# EasyEDA Pro project SOP100E 2025.05.27.eprj, schematic Schematic1, sheets 1 to 6 of 12

## Sheets
1 P1: Board Name: Board1; Create Date: 2026-01-14; Page Name: P1; Project Name: SOP100E 2025.05.27; Schematic Name: Schematic1; Update Date: 2026-01-20; Company: 嘉立创EDA; Page Size: A4; Version: V1.0
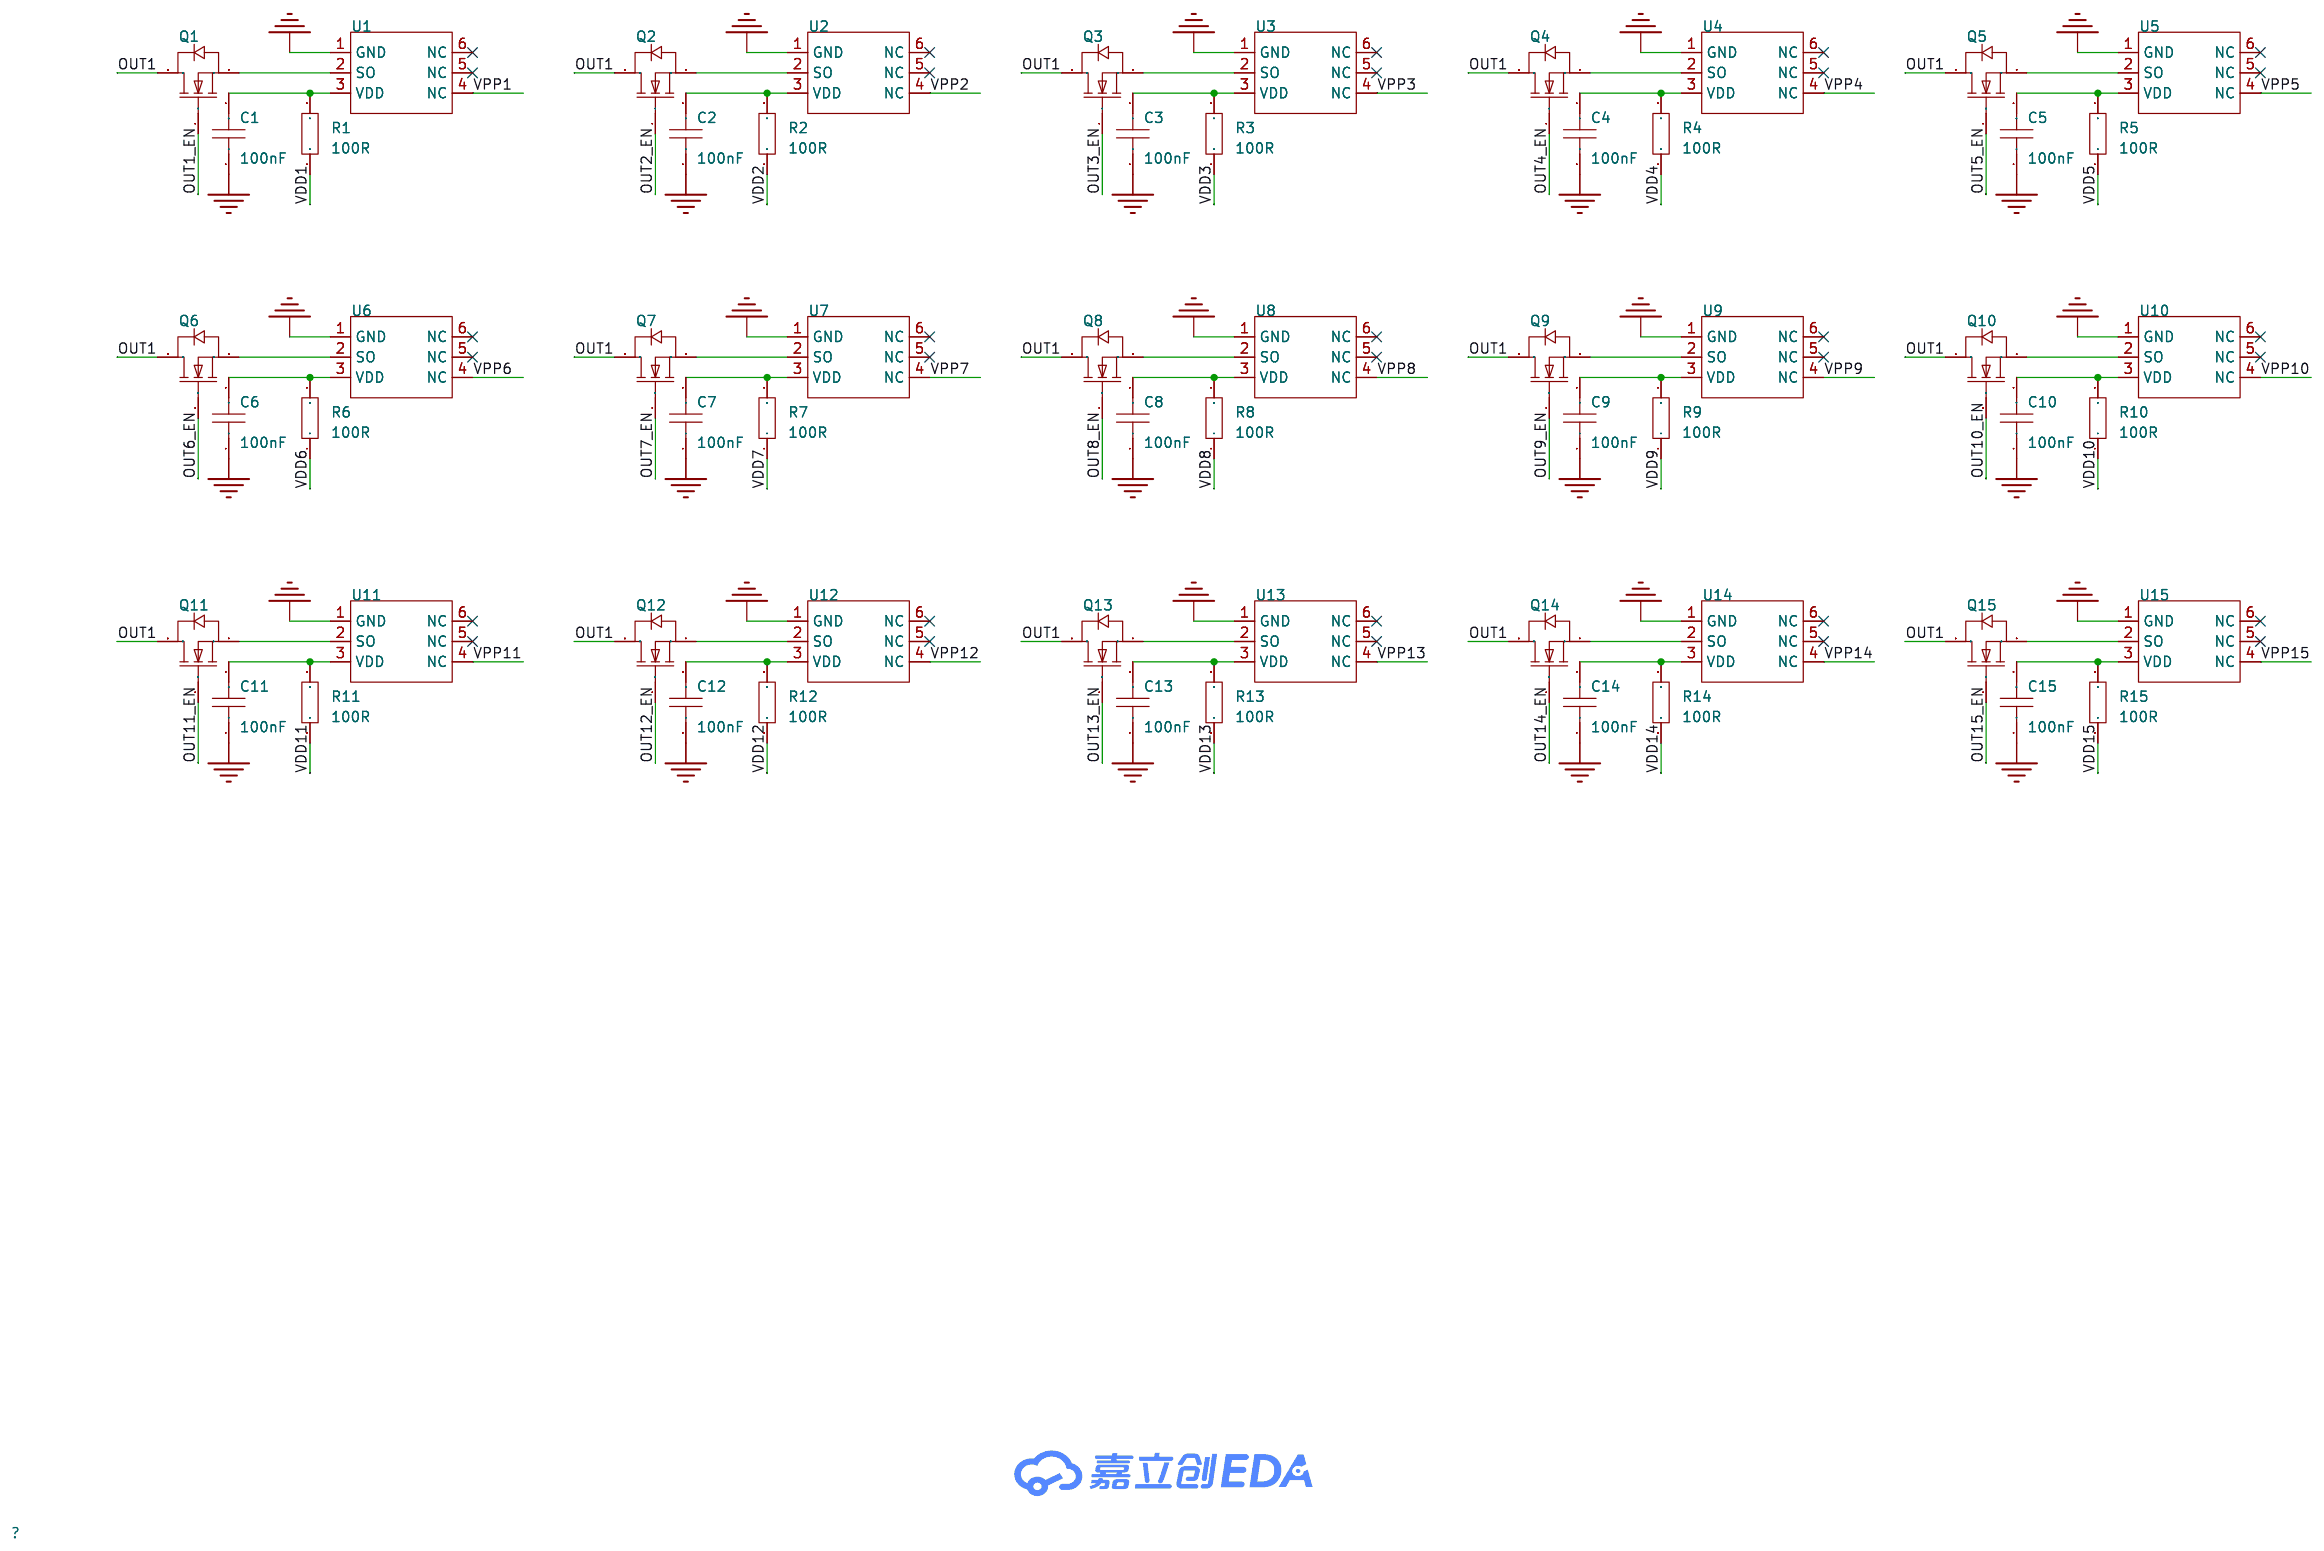
[diagram p0: P1]
2 P2: Page Name: P2
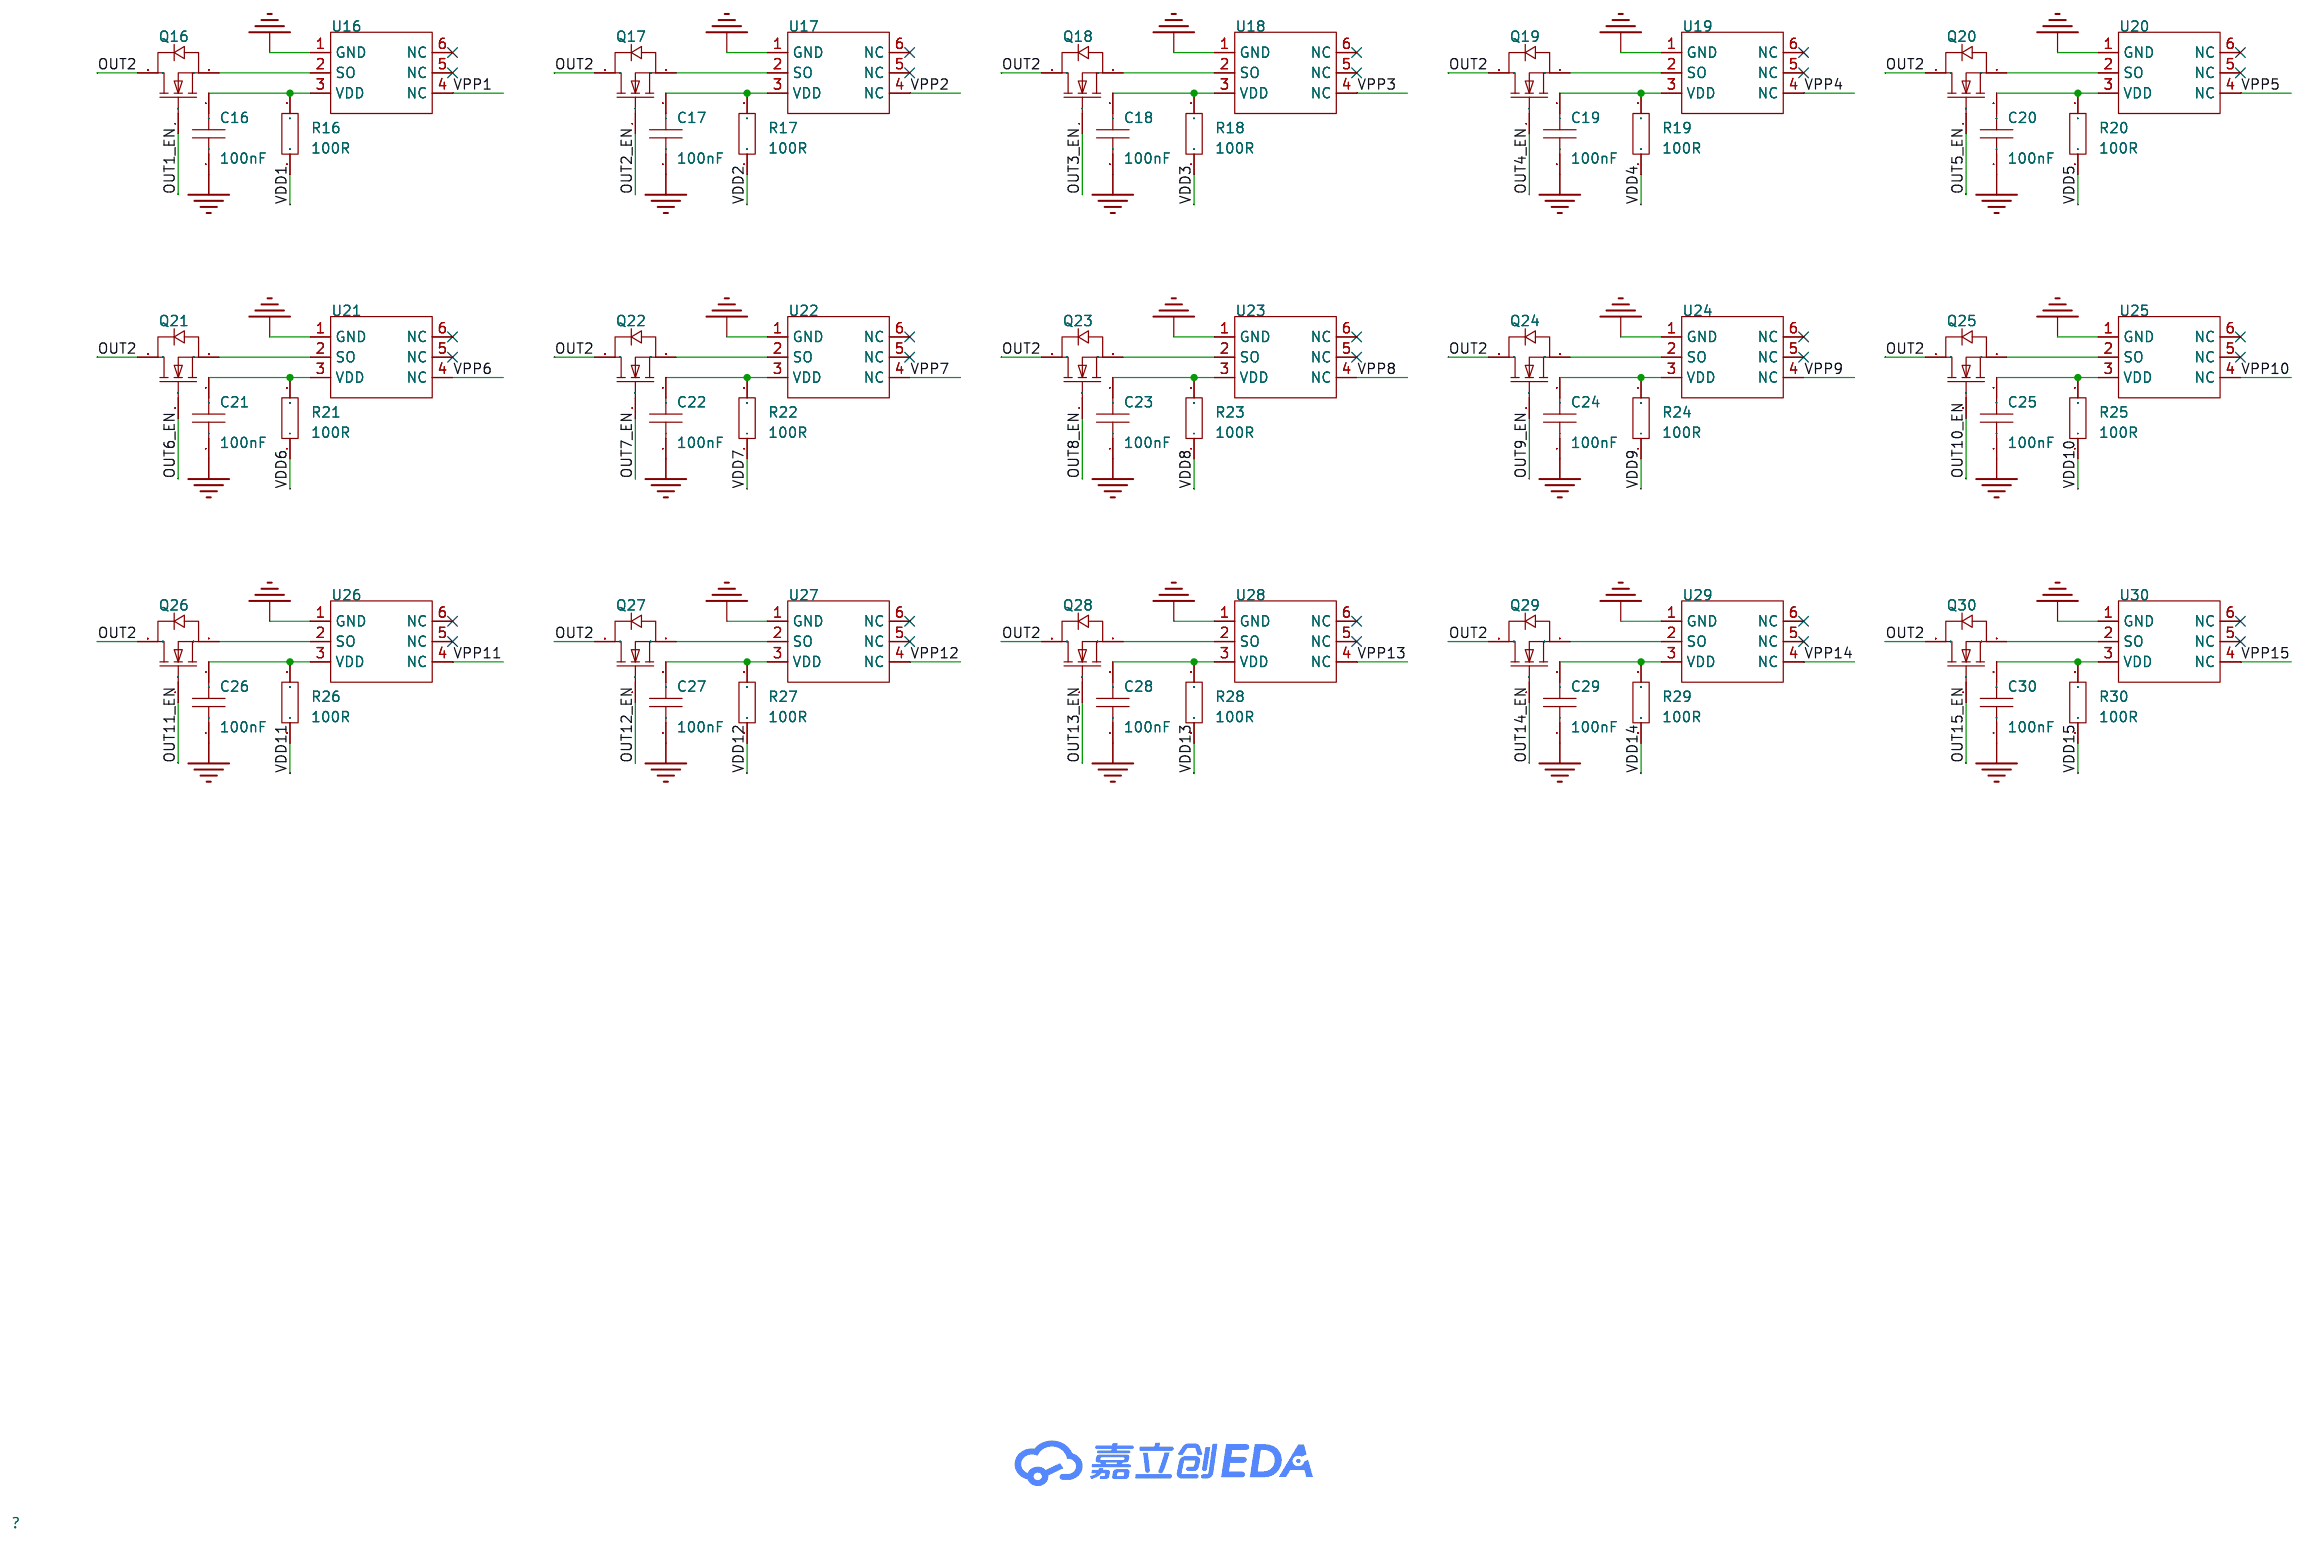
[diagram p1: P2]
3 P3: Page Name: P3; Update Date: 2026-01-16
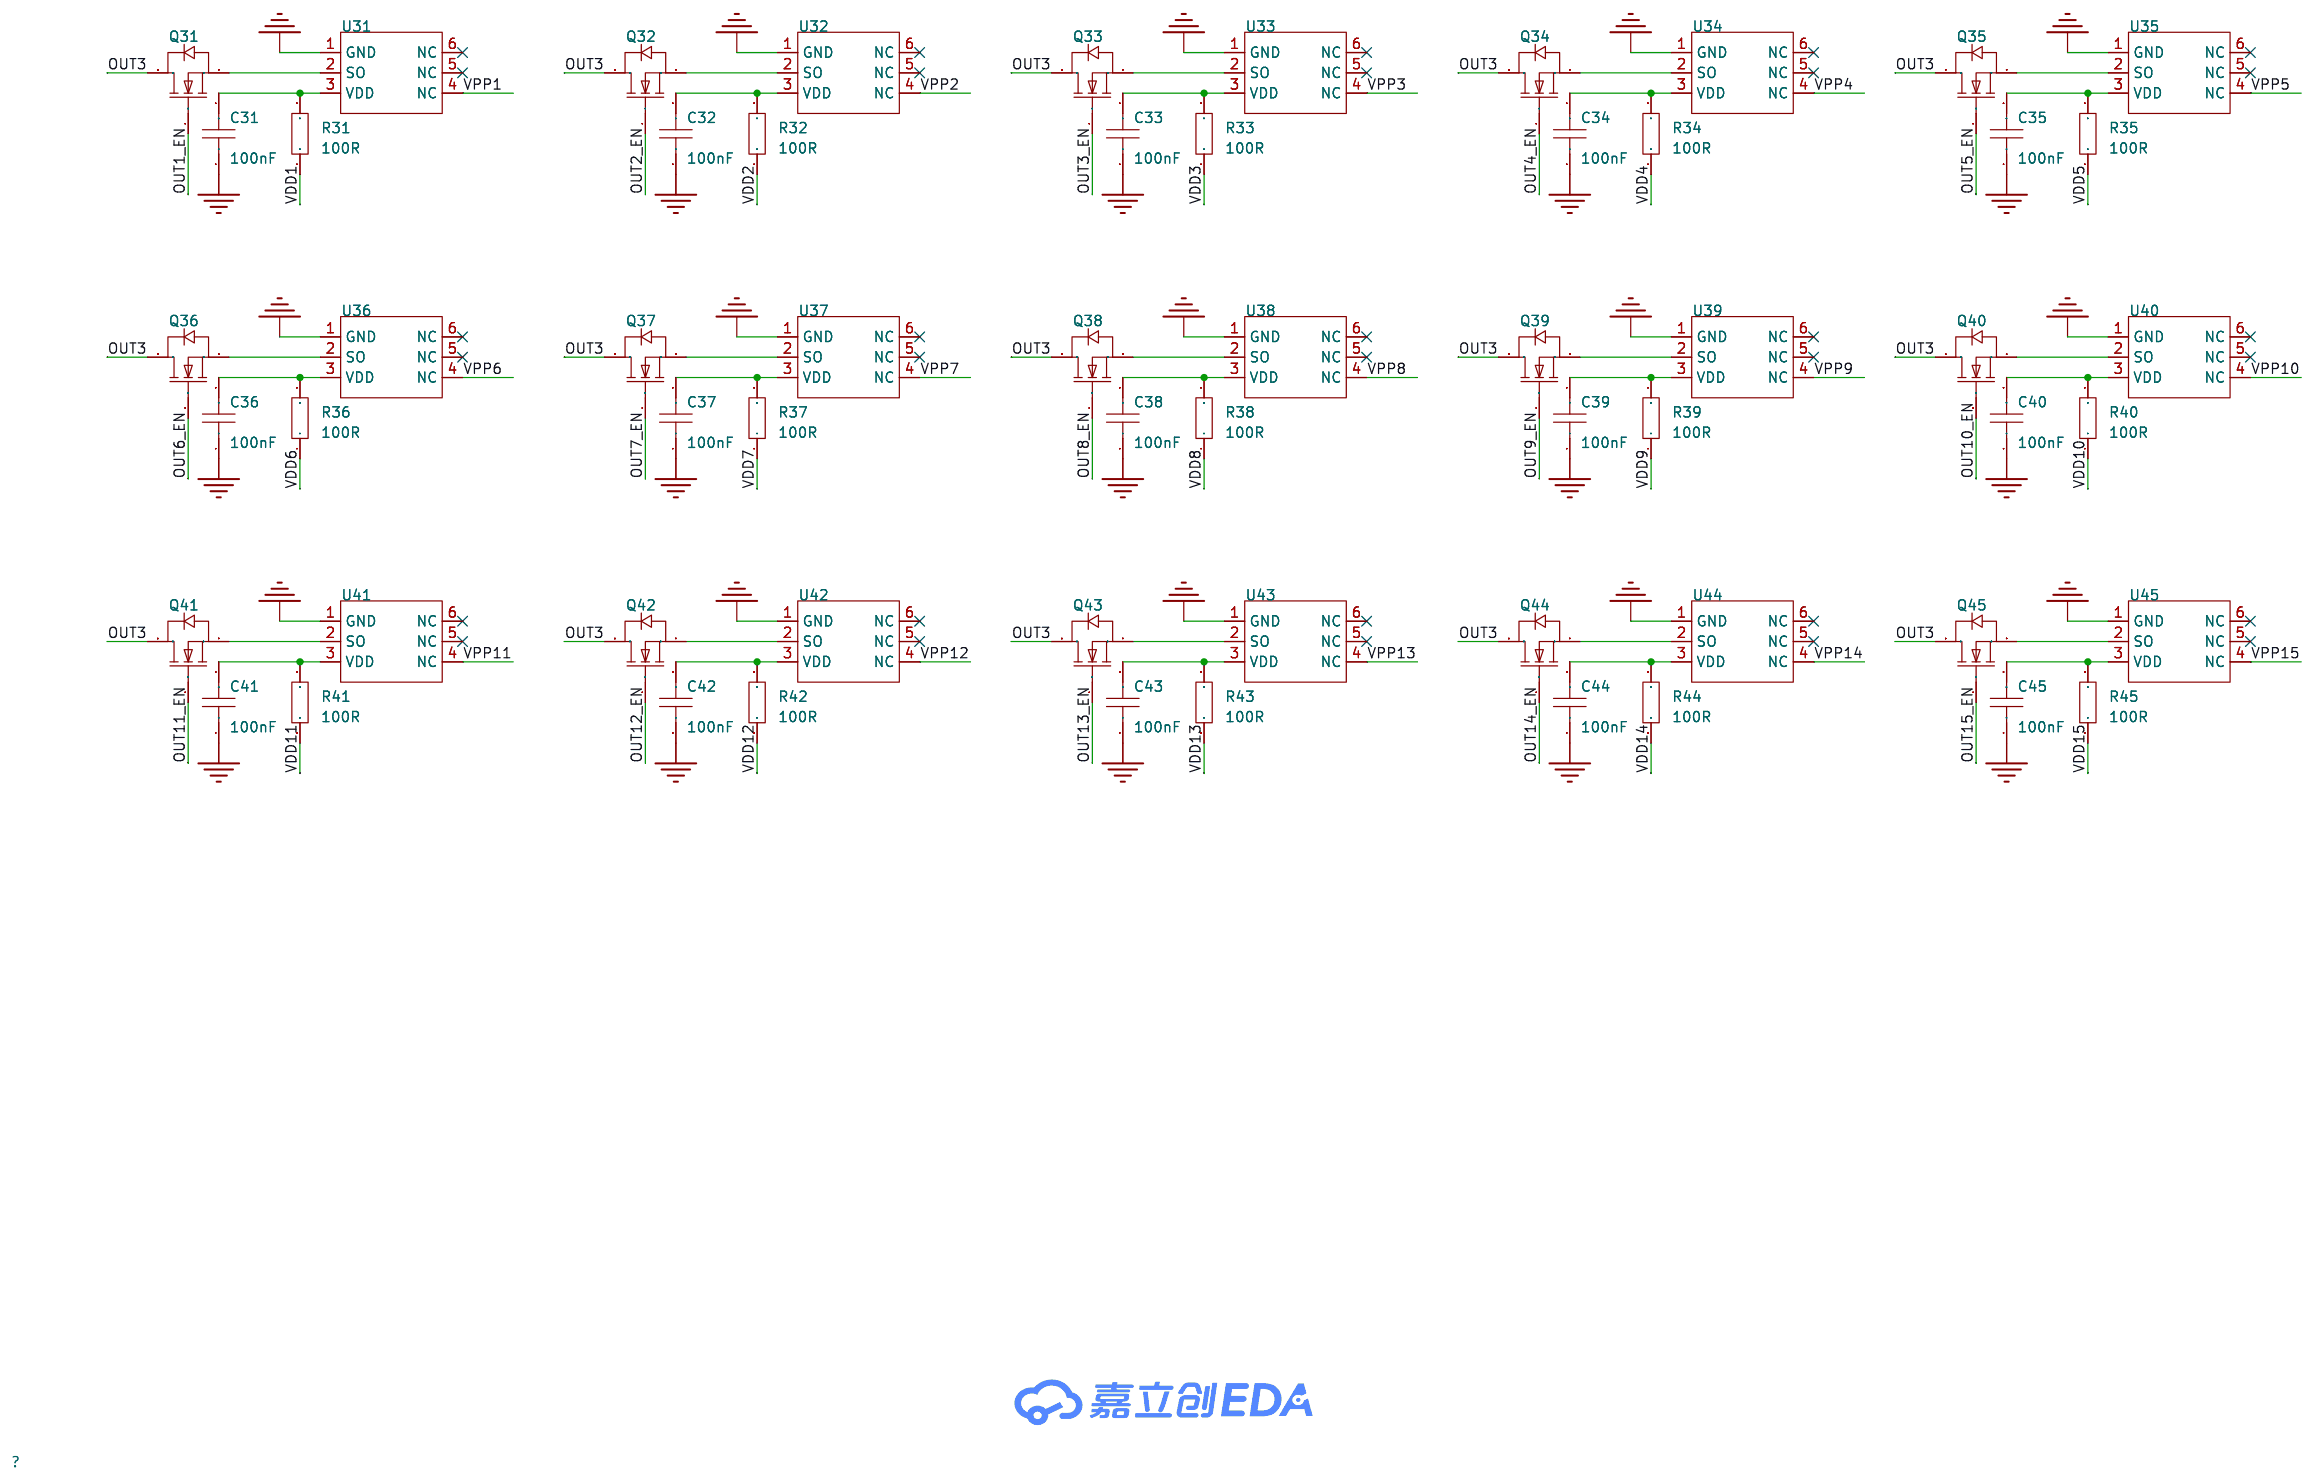
[diagram p2: P3]
4 P4: Page Name: P4; Update Date: 2026-01-16
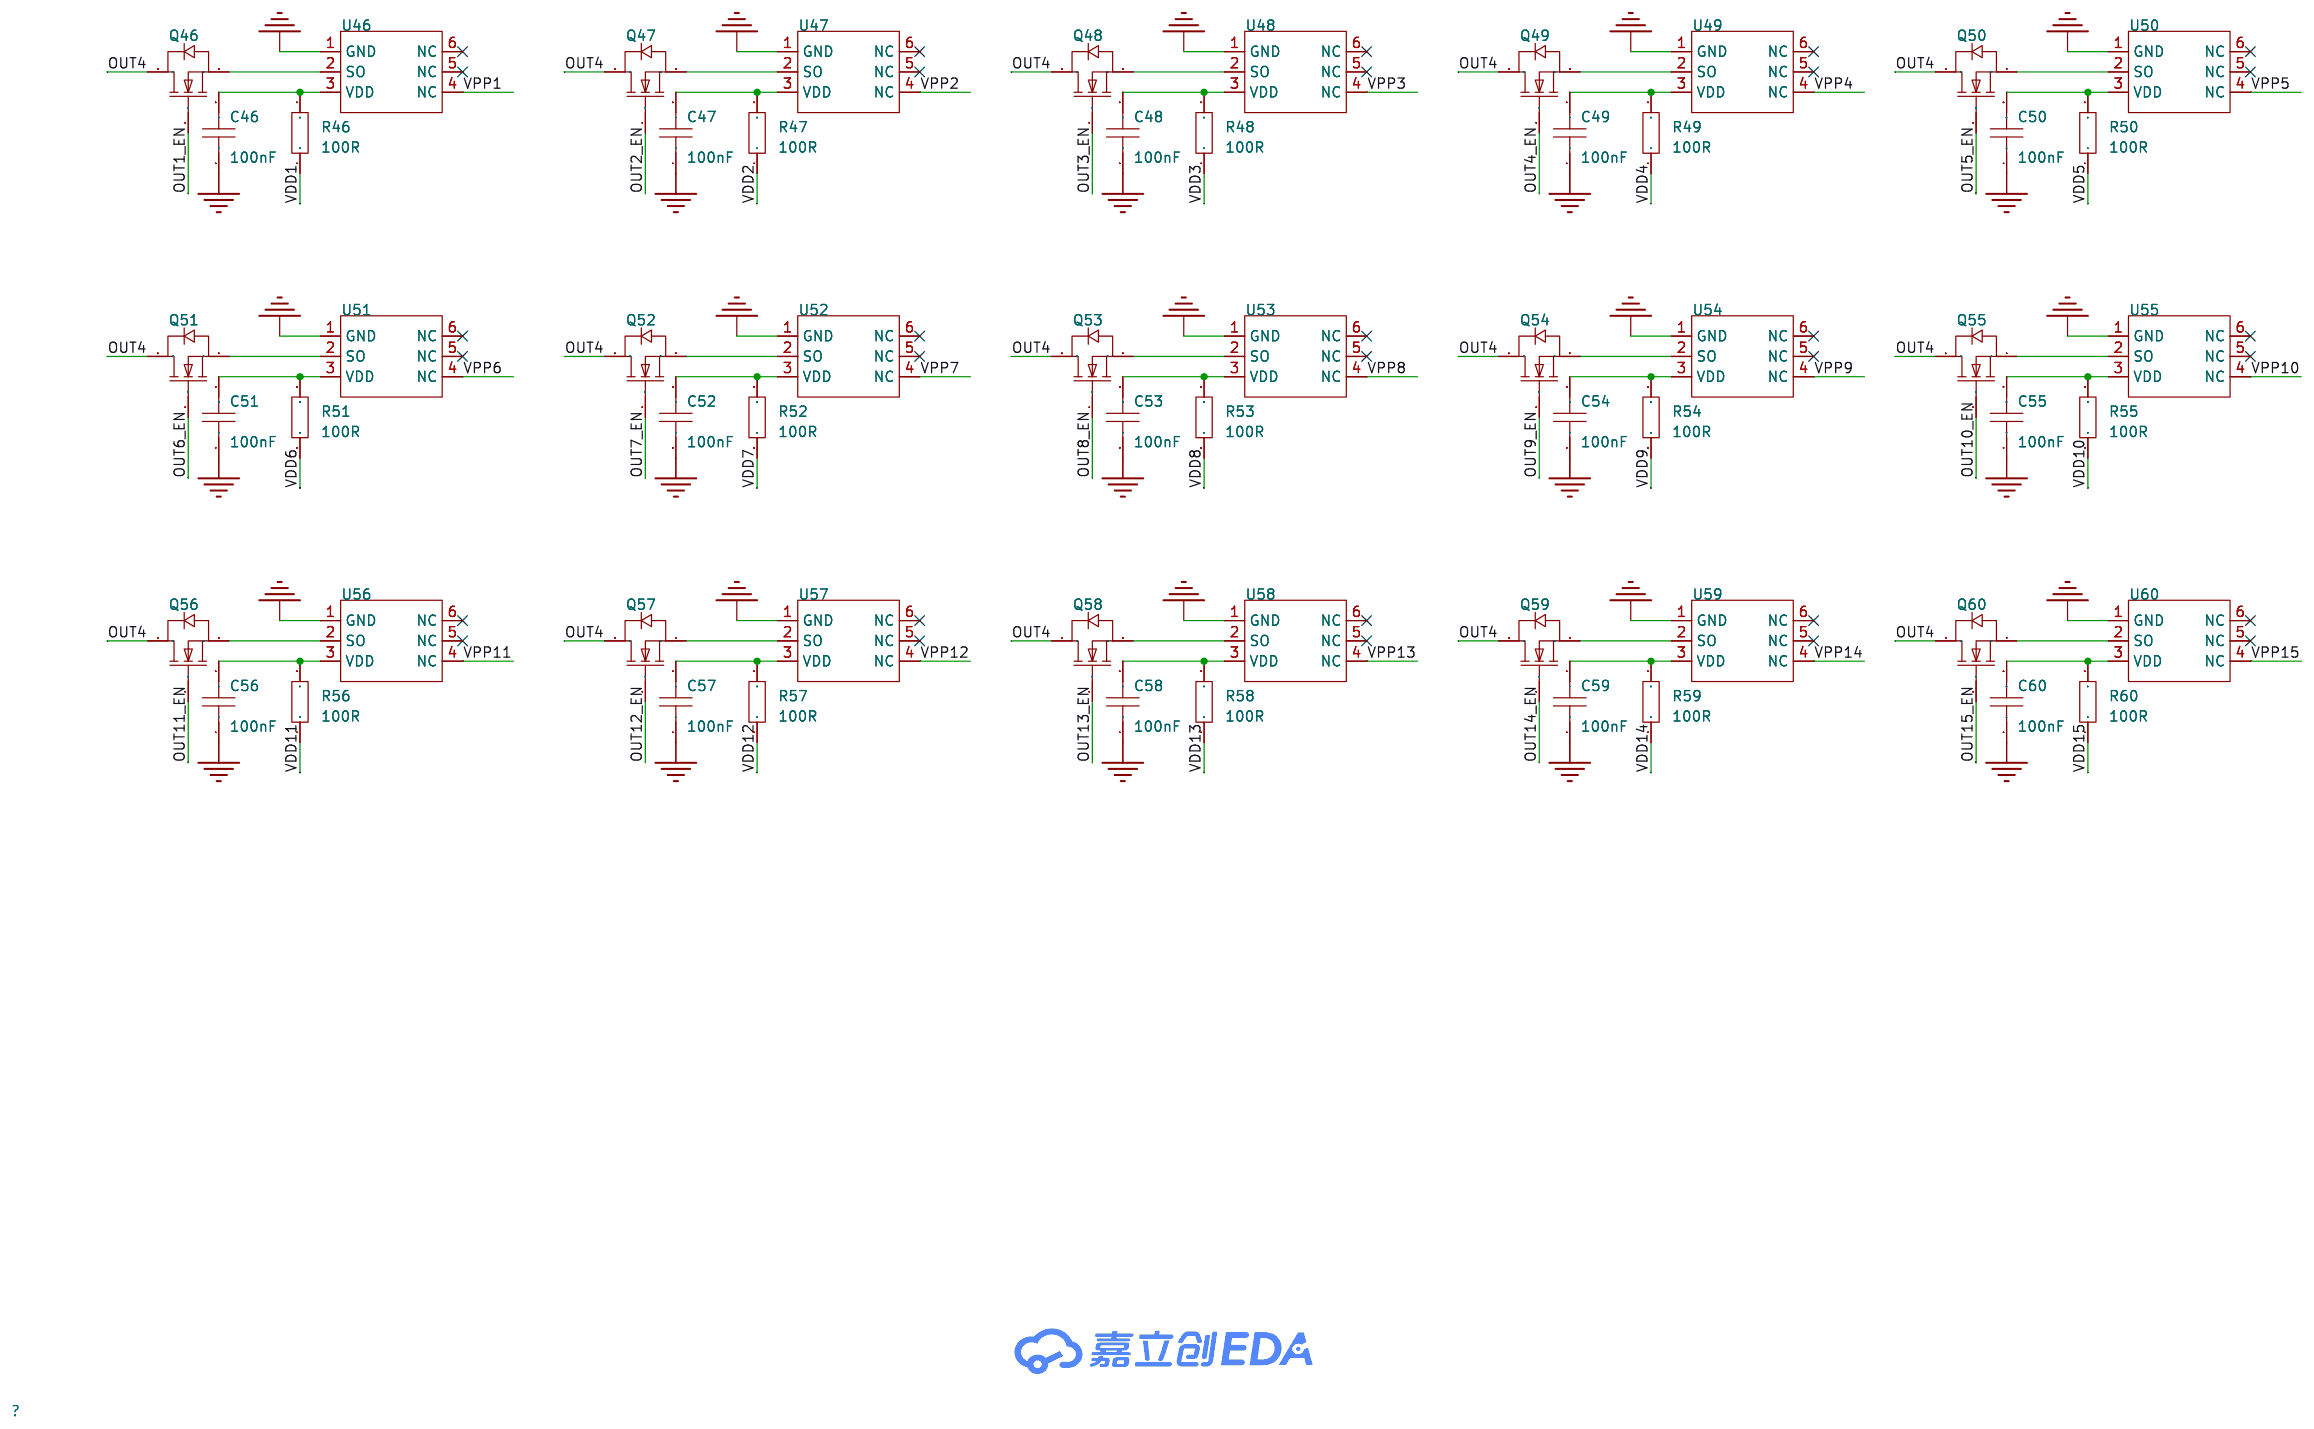
[diagram p3: P4]
5 P5: Page Name: P5; Update Date: 2026-01-16
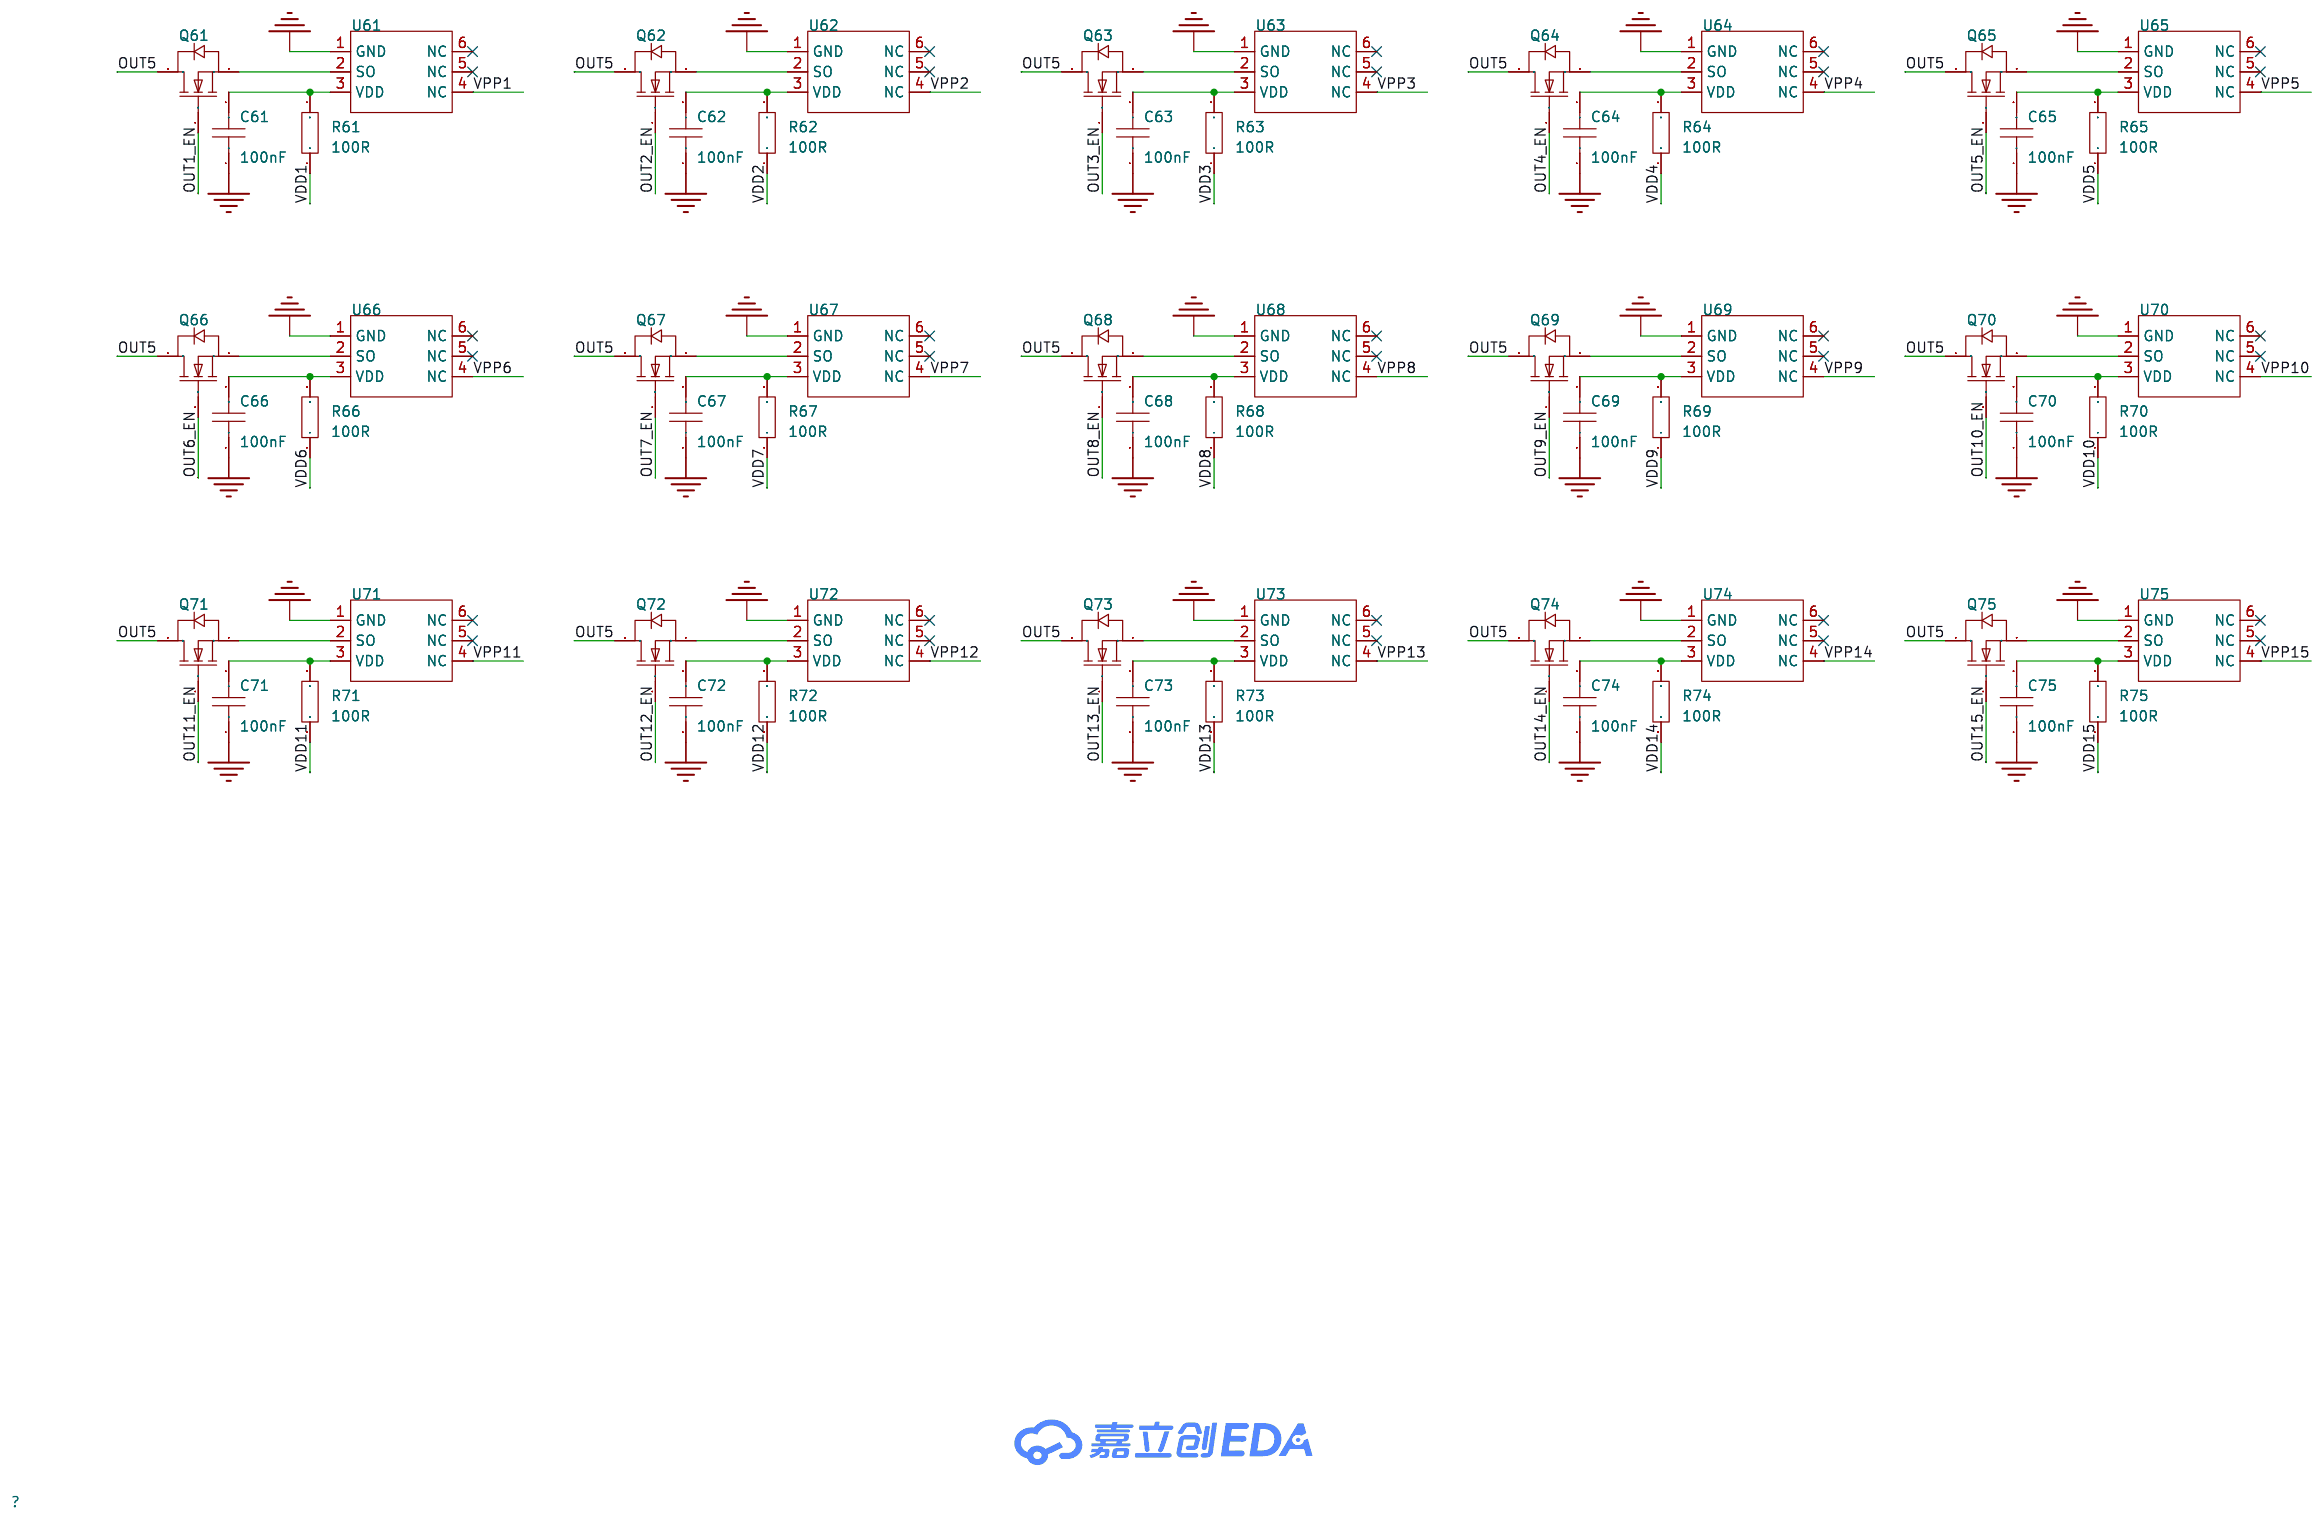
[diagram p4: P5]
6 P6: Page Name: P6; Update Date: 2026-01-16
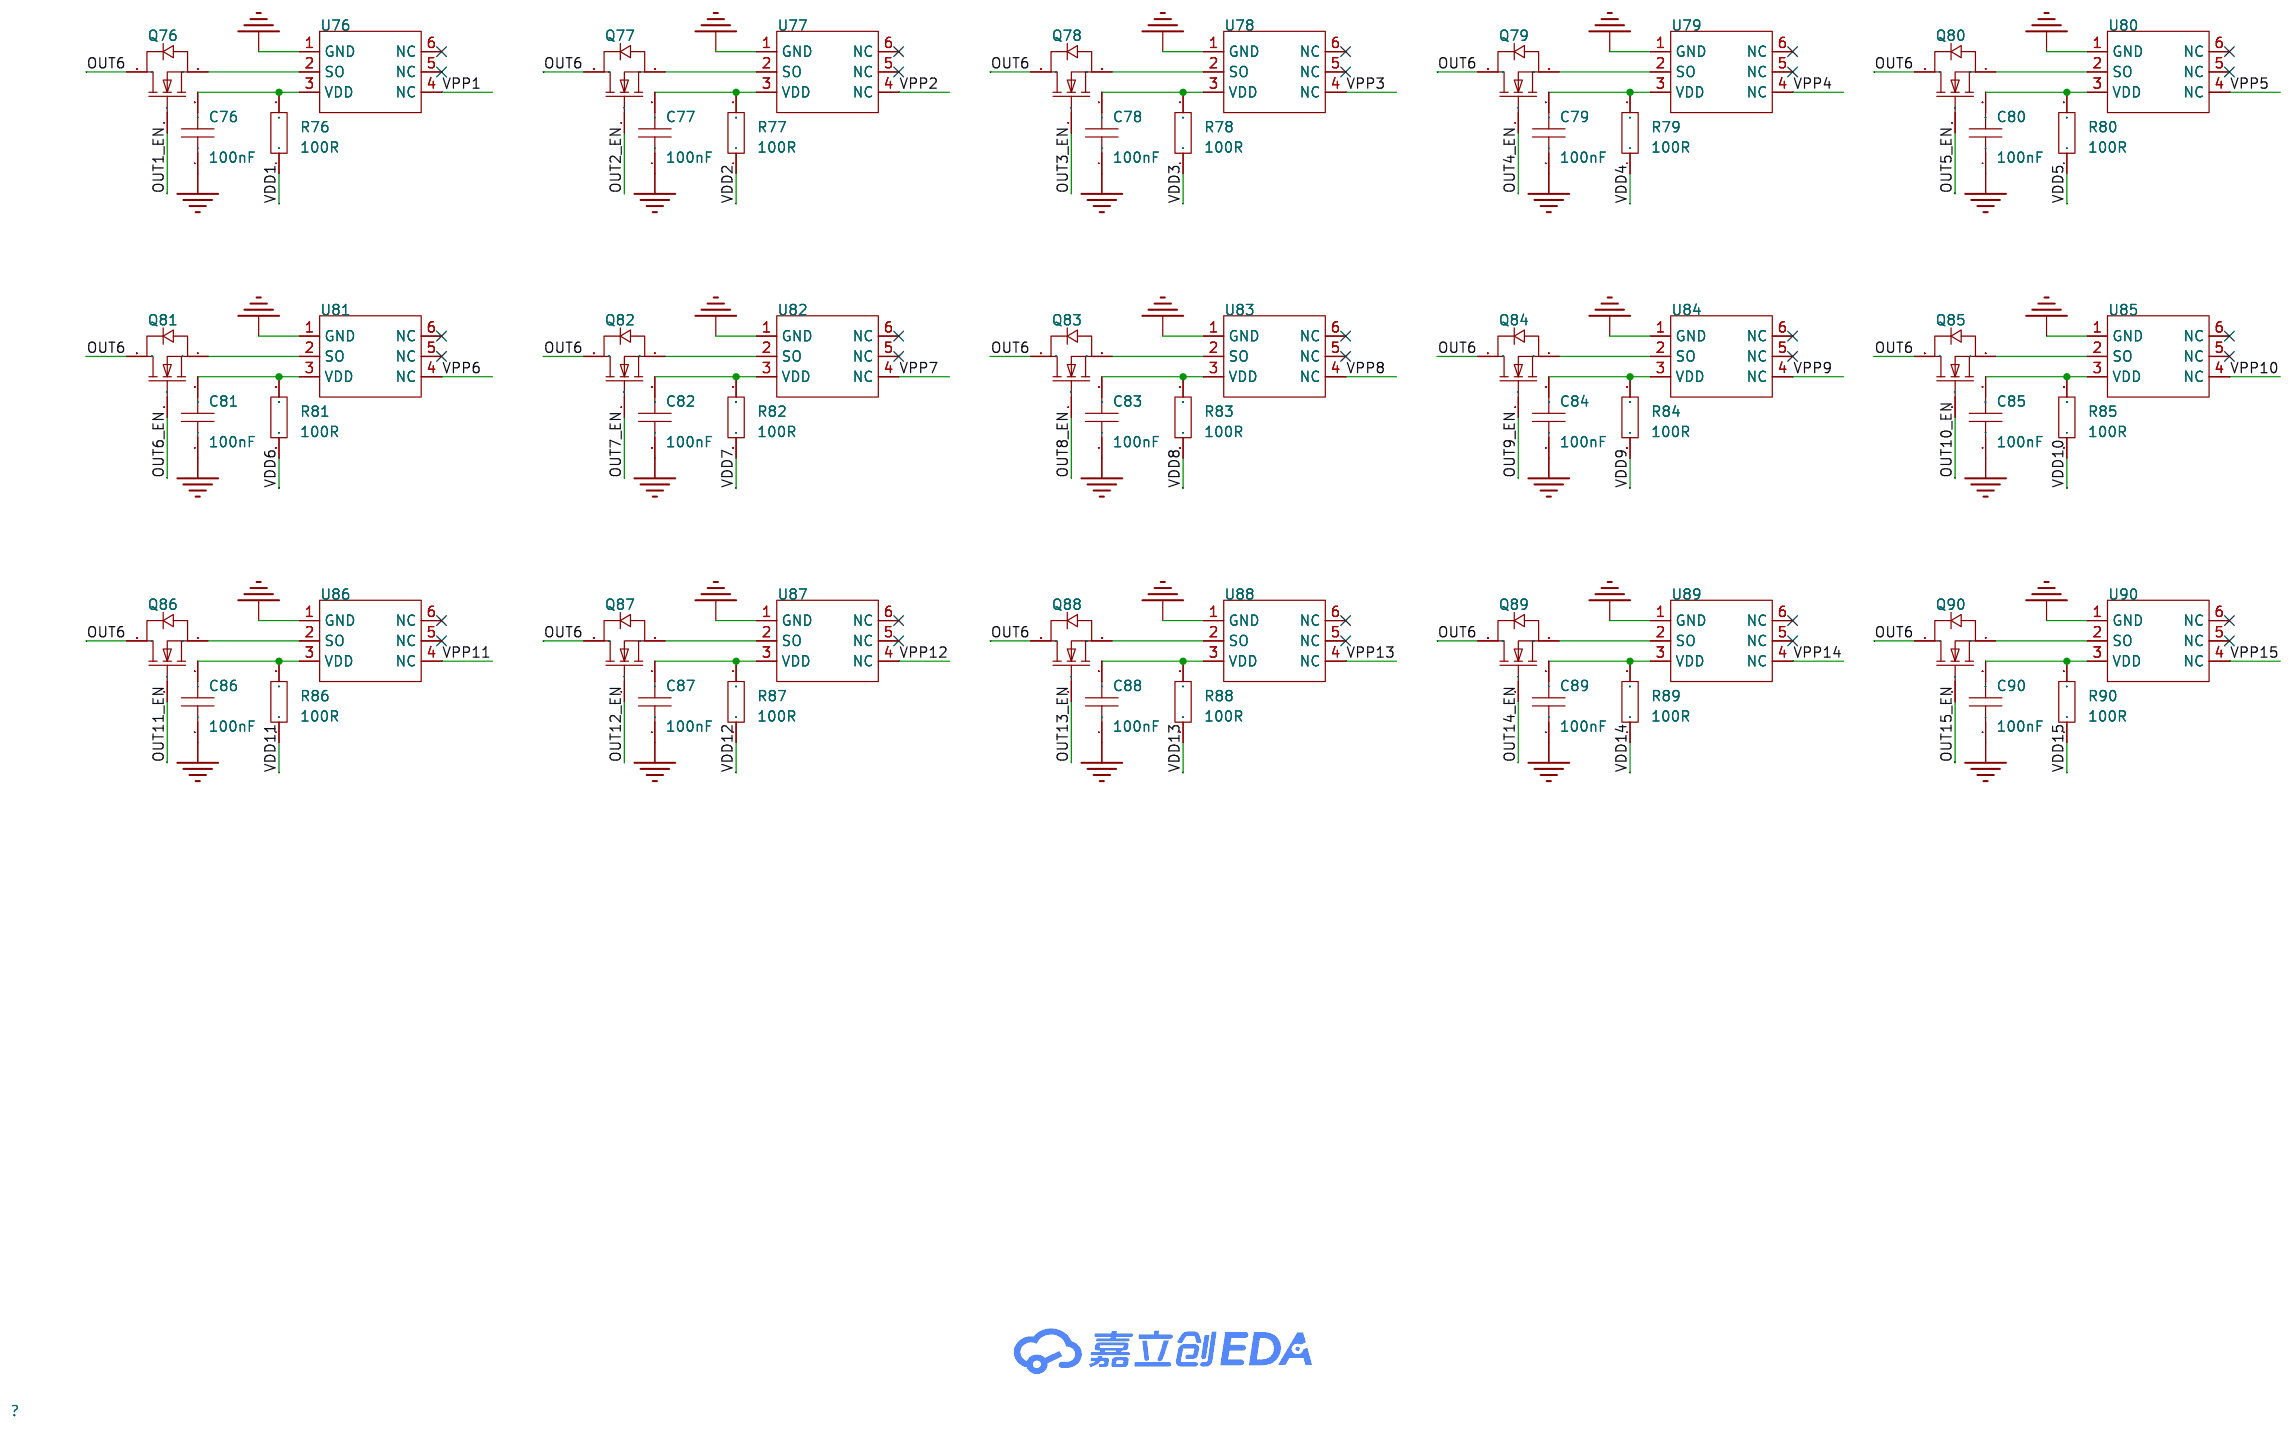
[diagram p5: P6]

## Parts
sheet P1
C1  100nF  [C0603]
C2  100nF  [C0603]
C3  100nF  [C0603]
C4  100nF  [C0603]
C5  100nF  [C0603]
C6  100nF  [C0603]
C7  100nF  [C0603]
C8  100nF  [C0603]
C9  100nF  [C0603]
C10  100nF  [C0603]
C11  100nF  [C0603]
C12  100nF  [C0603]
C13  100nF  [C0603]
C14  100nF  [C0603]
C15  100nF  [C0603]
Q1  AO3400A  [SOT-23-3_L2.9-W1.3-P1.90-LS2.4-BR]
Q2  AO3400A  [SOT-23-3_L2.9-W1.3-P1.90-LS2.4-BR]
Q3  AO3400A  [SOT-23-3_L2.9-W1.3-P1.90-LS2.4-BR]
Q4  AO3400A  [SOT-23-3_L2.9-W1.3-P1.90-LS2.4-BR]
Q5  AO3400A  [SOT-23-3_L2.9-W1.3-P1.90-LS2.4-BR]
Q6  AO3400A  [SOT-23-3_L2.9-W1.3-P1.90-LS2.4-BR]
Q7  AO3400A  [SOT-23-3_L2.9-W1.3-P1.90-LS2.4-BR]
Q8  AO3400A  [SOT-23-3_L2.9-W1.3-P1.90-LS2.4-BR]
Q9  AO3400A  [SOT-23-3_L2.9-W1.3-P1.90-LS2.4-BR]
Q10  AO3400A  [SOT-23-3_L2.9-W1.3-P1.90-LS2.4-BR]
Q11  AO3400A  [SOT-23-3_L2.9-W1.3-P1.90-LS2.4-BR]
Q12  AO3400A  [SOT-23-3_L2.9-W1.3-P1.90-LS2.4-BR]
Q13  AO3400A  [SOT-23-3_L2.9-W1.3-P1.90-LS2.4-BR]
Q14  AO3400A  [SOT-23-3_L2.9-W1.3-P1.90-LS2.4-BR]
Q15  AO3400A  [SOT-23-3_L2.9-W1.3-P1.90-LS2.4-BR]
R1  100R  [R0603]
R2  100R  [R0603]
R3  100R  [R0603]
R4  100R  [R0603]
R5  100R  [R0603]
R6  100R  [R0603]
R7  100R  [R0603]
R8  100R  [R0603]
R9  100R  [R0603]
R10  100R  [R0603]
R11  100R  [R0603]
R12  100R  [R0603]
R13  100R  [R0603]
R14  100R  [R0603]
R15  100R  [R0603]
U1  WF100E 1BG S6 DA 0.5P4.5 AT  [SOP-6_L7.0-W7.0-P2.54-LS10.3-TL-CW]
U2  WF100E 1BG S6 DA 0.5P4.5 AT  [SOP-6_L7.0-W7.0-P2.54-LS10.3-TL-CW]
U3  WF100E 1BG S6 DA 0.5P4.5 AT  [SOP-6_L7.0-W7.0-P2.54-LS10.3-TL-CW]
U4  WF100E 1BG S6 DA 0.5P4.5 AT  [SOP-6_L7.0-W7.0-P2.54-LS10.3-TL-CW]
U5  WF100E 1BG S6 DA 0.5P4.5 AT  [SOP-6_L7.0-W7.0-P2.54-LS10.3-TL-CW]
U6  WF100E 1BG S6 DA 0.5P4.5 AT  [SOP-6_L7.0-W7.0-P2.54-LS10.3-TL-CW]
U7  WF100E 1BG S6 DA 0.5P4.5 AT  [SOP-6_L7.0-W7.0-P2.54-LS10.3-TL-CW]
U8  WF100E 1BG S6 DA 0.5P4.5 AT  [SOP-6_L7.0-W7.0-P2.54-LS10.3-TL-CW]
U9  WF100E 1BG S6 DA 0.5P4.5 AT  [SOP-6_L7.0-W7.0-P2.54-LS10.3-TL-CW]
U10  WF100E 1BG S6 DA 0.5P4.5 AT  [SOP-6_L7.0-W7.0-P2.54-LS10.3-TL-CW]
U11  WF100E 1BG S6 DA 0.5P4.5 AT  [SOP-6_L7.0-W7.0-P2.54-LS10.3-TL-CW]
U12  WF100E 1BG S6 DA 0.5P4.5 AT  [SOP-6_L7.0-W7.0-P2.54-LS10.3-TL-CW]
U13  WF100E 1BG S6 DA 0.5P4.5 AT  [SOP-6_L7.0-W7.0-P2.54-LS10.3-TL-CW]
U14  WF100E 1BG S6 DA 0.5P4.5 AT  [SOP-6_L7.0-W7.0-P2.54-LS10.3-TL-CW]
U15  WF100E 1BG S6 DA 0.5P4.5 AT  [SOP-6_L7.0-W7.0-P2.54-LS10.3-TL-CW]
sheet P2
C16  100nF  [C0603]
C17  100nF  [C0603]
C18  100nF  [C0603]
C19  100nF  [C0603]
C20  100nF  [C0603]
C21  100nF  [C0603]
C22  100nF  [C0603]
C23  100nF  [C0603]
C24  100nF  [C0603]
C25  100nF  [C0603]
C26  100nF  [C0603]
C27  100nF  [C0603]
C28  100nF  [C0603]
C29  100nF  [C0603]
C30  100nF  [C0603]
Q16  AO3400A  [SOT-23-3_L2.9-W1.3-P1.90-LS2.4-BR]
Q17  AO3400A  [SOT-23-3_L2.9-W1.3-P1.90-LS2.4-BR]
Q18  AO3400A  [SOT-23-3_L2.9-W1.3-P1.90-LS2.4-BR]
Q19  AO3400A  [SOT-23-3_L2.9-W1.3-P1.90-LS2.4-BR]
Q20  AO3400A  [SOT-23-3_L2.9-W1.3-P1.90-LS2.4-BR]
Q21  AO3400A  [SOT-23-3_L2.9-W1.3-P1.90-LS2.4-BR]
Q22  AO3400A  [SOT-23-3_L2.9-W1.3-P1.90-LS2.4-BR]
Q23  AO3400A  [SOT-23-3_L2.9-W1.3-P1.90-LS2.4-BR]
Q24  AO3400A  [SOT-23-3_L2.9-W1.3-P1.90-LS2.4-BR]
Q25  AO3400A  [SOT-23-3_L2.9-W1.3-P1.90-LS2.4-BR]
Q26  AO3400A  [SOT-23-3_L2.9-W1.3-P1.90-LS2.4-BR]
Q27  AO3400A  [SOT-23-3_L2.9-W1.3-P1.90-LS2.4-BR]
Q28  AO3400A  [SOT-23-3_L2.9-W1.3-P1.90-LS2.4-BR]
Q29  AO3400A  [SOT-23-3_L2.9-W1.3-P1.90-LS2.4-BR]
Q30  AO3400A  [SOT-23-3_L2.9-W1.3-P1.90-LS2.4-BR]
R16  100R  [R0603]
R17  100R  [R0603]
R18  100R  [R0603]
R19  100R  [R0603]
R20  100R  [R0603]
R21  100R  [R0603]
R22  100R  [R0603]
R23  100R  [R0603]
R24  100R  [R0603]
R25  100R  [R0603]
R26  100R  [R0603]
R27  100R  [R0603]
R28  100R  [R0603]
R29  100R  [R0603]
R30  100R  [R0603]
U16  WF100E 1BG S6 DA 0.5P4.5 AT  [SOP-6_L7.0-W7.0-P2.54-LS10.3-TL-CW]
U17  WF100E 1BG S6 DA 0.5P4.5 AT  [SOP-6_L7.0-W7.0-P2.54-LS10.3-TL-CW]
U18  WF100E 1BG S6 DA 0.5P4.5 AT  [SOP-6_L7.0-W7.0-P2.54-LS10.3-TL-CW]
U19  WF100E 1BG S6 DA 0.5P4.5 AT  [SOP-6_L7.0-W7.0-P2.54-LS10.3-TL-CW]
U20  WF100E 1BG S6 DA 0.5P4.5 AT  [SOP-6_L7.0-W7.0-P2.54-LS10.3-TL-CW]
U21  WF100E 1BG S6 DA 0.5P4.5 AT  [SOP-6_L7.0-W7.0-P2.54-LS10.3-TL-CW]
U22  WF100E 1BG S6 DA 0.5P4.5 AT  [SOP-6_L7.0-W7.0-P2.54-LS10.3-TL-CW]
U23  WF100E 1BG S6 DA 0.5P4.5 AT  [SOP-6_L7.0-W7.0-P2.54-LS10.3-TL-CW]
U24  WF100E 1BG S6 DA 0.5P4.5 AT  [SOP-6_L7.0-W7.0-P2.54-LS10.3-TL-CW]
U25  WF100E 1BG S6 DA 0.5P4.5 AT  [SOP-6_L7.0-W7.0-P2.54-LS10.3-TL-CW]
U26  WF100E 1BG S6 DA 0.5P4.5 AT  [SOP-6_L7.0-W7.0-P2.54-LS10.3-TL-CW]
U27  WF100E 1BG S6 DA 0.5P4.5 AT  [SOP-6_L7.0-W7.0-P2.54-LS10.3-TL-CW]
U28  WF100E 1BG S6 DA 0.5P4.5 AT  [SOP-6_L7.0-W7.0-P2.54-LS10.3-TL-CW]
U29  WF100E 1BG S6 DA 0.5P4.5 AT  [SOP-6_L7.0-W7.0-P2.54-LS10.3-TL-CW]
U30  WF100E 1BG S6 DA 0.5P4.5 AT  [SOP-6_L7.0-W7.0-P2.54-LS10.3-TL-CW]
sheet P3
C31  100nF  [C0603]
C32  100nF  [C0603]
C33  100nF  [C0603]
C34  100nF  [C0603]
C35  100nF  [C0603]
C36  100nF  [C0603]
C37  100nF  [C0603]
C38  100nF  [C0603]
C39  100nF  [C0603]
C40  100nF  [C0603]
C41  100nF  [C0603]
C42  100nF  [C0603]
C43  100nF  [C0603]
C44  100nF  [C0603]
C45  100nF  [C0603]
Q31  AO3400A  [SOT-23-3_L2.9-W1.3-P1.90-LS2.4-BR]
Q32  AO3400A  [SOT-23-3_L2.9-W1.3-P1.90-LS2.4-BR]
Q33  AO3400A  [SOT-23-3_L2.9-W1.3-P1.90-LS2.4-BR]
Q34  AO3400A  [SOT-23-3_L2.9-W1.3-P1.90-LS2.4-BR]
Q35  AO3400A  [SOT-23-3_L2.9-W1.3-P1.90-LS2.4-BR]
Q36  AO3400A  [SOT-23-3_L2.9-W1.3-P1.90-LS2.4-BR]
Q37  AO3400A  [SOT-23-3_L2.9-W1.3-P1.90-LS2.4-BR]
Q38  AO3400A  [SOT-23-3_L2.9-W1.3-P1.90-LS2.4-BR]
Q39  AO3400A  [SOT-23-3_L2.9-W1.3-P1.90-LS2.4-BR]
Q40  AO3400A  [SOT-23-3_L2.9-W1.3-P1.90-LS2.4-BR]
Q41  AO3400A  [SOT-23-3_L2.9-W1.3-P1.90-LS2.4-BR]
Q42  AO3400A  [SOT-23-3_L2.9-W1.3-P1.90-LS2.4-BR]
Q43  AO3400A  [SOT-23-3_L2.9-W1.3-P1.90-LS2.4-BR]
Q44  AO3400A  [SOT-23-3_L2.9-W1.3-P1.90-LS2.4-BR]
Q45  AO3400A  [SOT-23-3_L2.9-W1.3-P1.90-LS2.4-BR]
R31  100R  [R0603]
R32  100R  [R0603]
R33  100R  [R0603]
R34  100R  [R0603]
R35  100R  [R0603]
R36  100R  [R0603]
R37  100R  [R0603]
R38  100R  [R0603]
R39  100R  [R0603]
R40  100R  [R0603]
R41  100R  [R0603]
R42  100R  [R0603]
R43  100R  [R0603]
R44  100R  [R0603]
R45  100R  [R0603]
U31  WF100E 1BG S6 DA 0.5P4.5 AT  [SOP-6_L7.0-W7.0-P2.54-LS10.3-TL-CW]
U32  WF100E 1BG S6 DA 0.5P4.5 AT  [SOP-6_L7.0-W7.0-P2.54-LS10.3-TL-CW]
U33  WF100E 1BG S6 DA 0.5P4.5 AT  [SOP-6_L7.0-W7.0-P2.54-LS10.3-TL-CW]
U34  WF100E 1BG S6 DA 0.5P4.5 AT  [SOP-6_L7.0-W7.0-P2.54-LS10.3-TL-CW]
U35  WF100E 1BG S6 DA 0.5P4.5 AT  [SOP-6_L7.0-W7.0-P2.54-LS10.3-TL-CW]
U36  WF100E 1BG S6 DA 0.5P4.5 AT  [SOP-6_L7.0-W7.0-P2.54-LS10.3-TL-CW]
U37  WF100E 1BG S6 DA 0.5P4.5 AT  [SOP-6_L7.0-W7.0-P2.54-LS10.3-TL-CW]
U38  WF100E 1BG S6 DA 0.5P4.5 AT  [SOP-6_L7.0-W7.0-P2.54-LS10.3-TL-CW]
U39  WF100E 1BG S6 DA 0.5P4.5 AT  [SOP-6_L7.0-W7.0-P2.54-LS10.3-TL-CW]
U40  WF100E 1BG S6 DA 0.5P4.5 AT  [SOP-6_L7.0-W7.0-P2.54-LS10.3-TL-CW]
U41  WF100E 1BG S6 DA 0.5P4.5 AT  [SOP-6_L7.0-W7.0-P2.54-LS10.3-TL-CW]
U42  WF100E 1BG S6 DA 0.5P4.5 AT  [SOP-6_L7.0-W7.0-P2.54-LS10.3-TL-CW]
U43  WF100E 1BG S6 DA 0.5P4.5 AT  [SOP-6_L7.0-W7.0-P2.54-LS10.3-TL-CW]
U44  WF100E 1BG S6 DA 0.5P4.5 AT  [SOP-6_L7.0-W7.0-P2.54-LS10.3-TL-CW]
U45  WF100E 1BG S6 DA 0.5P4.5 AT  [SOP-6_L7.0-W7.0-P2.54-LS10.3-TL-CW]
sheet P4
C46  100nF  [C0603]
C47  100nF  [C0603]
C48  100nF  [C0603]
C49  100nF  [C0603]
C50  100nF  [C0603]
C51  100nF  [C0603]
C52  100nF  [C0603]
C53  100nF  [C0603]
C54  100nF  [C0603]
C55  100nF  [C0603]
C56  100nF  [C0603]
C57  100nF  [C0603]
C58  100nF  [C0603]
C59  100nF  [C0603]
C60  100nF  [C0603]
Q46  AO3400A  [SOT-23-3_L2.9-W1.3-P1.90-LS2.4-BR]
Q47  AO3400A  [SOT-23-3_L2.9-W1.3-P1.90-LS2.4-BR]
Q48  AO3400A  [SOT-23-3_L2.9-W1.3-P1.90-LS2.4-BR]
Q49  AO3400A  [SOT-23-3_L2.9-W1.3-P1.90-LS2.4-BR]
Q50  AO3400A  [SOT-23-3_L2.9-W1.3-P1.90-LS2.4-BR]
Q51  AO3400A  [SOT-23-3_L2.9-W1.3-P1.90-LS2.4-BR]
Q52  AO3400A  [SOT-23-3_L2.9-W1.3-P1.90-LS2.4-BR]
Q53  AO3400A  [SOT-23-3_L2.9-W1.3-P1.90-LS2.4-BR]
Q54  AO3400A  [SOT-23-3_L2.9-W1.3-P1.90-LS2.4-BR]
Q55  AO3400A  [SOT-23-3_L2.9-W1.3-P1.90-LS2.4-BR]
Q56  AO3400A  [SOT-23-3_L2.9-W1.3-P1.90-LS2.4-BR]
Q57  AO3400A  [SOT-23-3_L2.9-W1.3-P1.90-LS2.4-BR]
Q58  AO3400A  [SOT-23-3_L2.9-W1.3-P1.90-LS2.4-BR]
Q59  AO3400A  [SOT-23-3_L2.9-W1.3-P1.90-LS2.4-BR]
Q60  AO3400A  [SOT-23-3_L2.9-W1.3-P1.90-LS2.4-BR]
R46  100R  [R0603]
R47  100R  [R0603]
R48  100R  [R0603]
R49  100R  [R0603]
R50  100R  [R0603]
R51  100R  [R0603]
R52  100R  [R0603]
R53  100R  [R0603]
R54  100R  [R0603]
R55  100R  [R0603]
R56  100R  [R0603]
R57  100R  [R0603]
R58  100R  [R0603]
R59  100R  [R0603]
R60  100R  [R0603]
U46  WF100E 1BG S6 DA 0.5P4.5 AT  [SOP-6_L7.0-W7.0-P2.54-LS10.3-TL-CW]
U47  WF100E 1BG S6 DA 0.5P4.5 AT  [SOP-6_L7.0-W7.0-P2.54-LS10.3-TL-CW]
U48  WF100E 1BG S6 DA 0.5P4.5 AT  [SOP-6_L7.0-W7.0-P2.54-LS10.3-TL-CW]
U49  WF100E 1BG S6 DA 0.5P4.5 AT  [SOP-6_L7.0-W7.0-P2.54-LS10.3-TL-CW]
U50  WF100E 1BG S6 DA 0.5P4.5 AT  [SOP-6_L7.0-W7.0-P2.54-LS10.3-TL-CW]
U51  WF100E 1BG S6 DA 0.5P4.5 AT  [SOP-6_L7.0-W7.0-P2.54-LS10.3-TL-CW]
U52  WF100E 1BG S6 DA 0.5P4.5 AT  [SOP-6_L7.0-W7.0-P2.54-LS10.3-TL-CW]
U53  WF100E 1BG S6 DA 0.5P4.5 AT  [SOP-6_L7.0-W7.0-P2.54-LS10.3-TL-CW]
U54  WF100E 1BG S6 DA 0.5P4.5 AT  [SOP-6_L7.0-W7.0-P2.54-LS10.3-TL-CW]
U55  WF100E 1BG S6 DA 0.5P4.5 AT  [SOP-6_L7.0-W7.0-P2.54-LS10.3-TL-CW]
U56  WF100E 1BG S6 DA 0.5P4.5 AT  [SOP-6_L7.0-W7.0-P2.54-LS10.3-TL-CW]
U57  WF100E 1BG S6 DA 0.5P4.5 AT  [SOP-6_L7.0-W7.0-P2.54-LS10.3-TL-CW]
U58  WF100E 1BG S6 DA 0.5P4.5 AT  [SOP-6_L7.0-W7.0-P2.54-LS10.3-TL-CW]
U59  WF100E 1BG S6 DA 0.5P4.5 AT  [SOP-6_L7.0-W7.0-P2.54-LS10.3-TL-CW]
U60  WF100E 1BG S6 DA 0.5P4.5 AT  [SOP-6_L7.0-W7.0-P2.54-LS10.3-TL-CW]
sheet P5
C61  100nF  [C0603]
C62  100nF  [C0603]
C63  100nF  [C0603]
C64  100nF  [C0603]
C65  100nF  [C0603]
C66  100nF  [C0603]
C67  100nF  [C0603]
C68  100nF  [C0603]
C69  100nF  [C0603]
C70  100nF  [C0603]
C71  100nF  [C0603]
C72  100nF  [C0603]
C73  100nF  [C0603]
C74  100nF  [C0603]
C75  100nF  [C0603]
Q61  AO3400A  [SOT-23-3_L2.9-W1.3-P1.90-LS2.4-BR]
Q62  AO3400A  [SOT-23-3_L2.9-W1.3-P1.90-LS2.4-BR]
Q63  AO3400A  [SOT-23-3_L2.9-W1.3-P1.90-LS2.4-BR]
Q64  AO3400A  [SOT-23-3_L2.9-W1.3-P1.90-LS2.4-BR]
Q65  AO3400A  [SOT-23-3_L2.9-W1.3-P1.90-LS2.4-BR]
Q66  AO3400A  [SOT-23-3_L2.9-W1.3-P1.90-LS2.4-BR]
Q67  AO3400A  [SOT-23-3_L2.9-W1.3-P1.90-LS2.4-BR]
Q68  AO3400A  [SOT-23-3_L2.9-W1.3-P1.90-LS2.4-BR]
Q69  AO3400A  [SOT-23-3_L2.9-W1.3-P1.90-LS2.4-BR]
Q70  AO3400A  [SOT-23-3_L2.9-W1.3-P1.90-LS2.4-BR]
Q71  AO3400A  [SOT-23-3_L2.9-W1.3-P1.90-LS2.4-BR]
Q72  AO3400A  [SOT-23-3_L2.9-W1.3-P1.90-LS2.4-BR]
Q73  AO3400A  [SOT-23-3_L2.9-W1.3-P1.90-LS2.4-BR]
Q74  AO3400A  [SOT-23-3_L2.9-W1.3-P1.90-LS2.4-BR]
Q75  AO3400A  [SOT-23-3_L2.9-W1.3-P1.90-LS2.4-BR]
R61  100R  [R0603]
R62  100R  [R0603]
R63  100R  [R0603]
R64  100R  [R0603]
R65  100R  [R0603]
R66  100R  [R0603]
R67  100R  [R0603]
R68  100R  [R0603]
R69  100R  [R0603]
R70  100R  [R0603]
R71  100R  [R0603]
R72  100R  [R0603]
R73  100R  [R0603]
R74  100R  [R0603]
R75  100R  [R0603]
U61  WF100E 1BG S6 DA 0.5P4.5 AT  [SOP-6_L7.0-W7.0-P2.54-LS10.3-TL-CW]
U62  WF100E 1BG S6 DA 0.5P4.5 AT  [SOP-6_L7.0-W7.0-P2.54-LS10.3-TL-CW]
U63  WF100E 1BG S6 DA 0.5P4.5 AT  [SOP-6_L7.0-W7.0-P2.54-LS10.3-TL-CW]
U64  WF100E 1BG S6 DA 0.5P4.5 AT  [SOP-6_L7.0-W7.0-P2.54-LS10.3-TL-CW]
U65  WF100E 1BG S6 DA 0.5P4.5 AT  [SOP-6_L7.0-W7.0-P2.54-LS10.3-TL-CW]
U66  WF100E 1BG S6 DA 0.5P4.5 AT  [SOP-6_L7.0-W7.0-P2.54-LS10.3-TL-CW]
U67  WF100E 1BG S6 DA 0.5P4.5 AT  [SOP-6_L7.0-W7.0-P2.54-LS10.3-TL-CW]
U68  WF100E 1BG S6 DA 0.5P4.5 AT  [SOP-6_L7.0-W7.0-P2.54-LS10.3-TL-CW]
U69  WF100E 1BG S6 DA 0.5P4.5 AT  [SOP-6_L7.0-W7.0-P2.54-LS10.3-TL-CW]
U70  WF100E 1BG S6 DA 0.5P4.5 AT  [SOP-6_L7.0-W7.0-P2.54-LS10.3-TL-CW]
U71  WF100E 1BG S6 DA 0.5P4.5 AT  [SOP-6_L7.0-W7.0-P2.54-LS10.3-TL-CW]
U72  WF100E 1BG S6 DA 0.5P4.5 AT  [SOP-6_L7.0-W7.0-P2.54-LS10.3-TL-CW]
U73  WF100E 1BG S6 DA 0.5P4.5 AT  [SOP-6_L7.0-W7.0-P2.54-LS10.3-TL-CW]
U74  WF100E 1BG S6 DA 0.5P4.5 AT  [SOP-6_L7.0-W7.0-P2.54-LS10.3-TL-CW]
U75  WF100E 1BG S6 DA 0.5P4.5 AT  [SOP-6_L7.0-W7.0-P2.54-LS10.3-TL-CW]
sheet P6
C76  100nF  [C0603]
C77  100nF  [C0603]
C78  100nF  [C0603]
C79  100nF  [C0603]
C80  100nF  [C0603]
C81  100nF  [C0603]
C82  100nF  [C0603]
C83  100nF  [C0603]
C84  100nF  [C0603]
C85  100nF  [C0603]
C86  100nF  [C0603]
C87  100nF  [C0603]
C88  100nF  [C0603]
C89  100nF  [C0603]
C90  100nF  [C0603]
Q76  AO3400A  [SOT-23-3_L2.9-W1.3-P1.90-LS2.4-BR]
Q77  AO3400A  [SOT-23-3_L2.9-W1.3-P1.90-LS2.4-BR]
Q78  AO3400A  [SOT-23-3_L2.9-W1.3-P1.90-LS2.4-BR]
Q79  AO3400A  [SOT-23-3_L2.9-W1.3-P1.90-LS2.4-BR]
Q80  AO3400A  [SOT-23-3_L2.9-W1.3-P1.90-LS2.4-BR]
Q81  AO3400A  [SOT-23-3_L2.9-W1.3-P1.90-LS2.4-BR]
Q82  AO3400A  [SOT-23-3_L2.9-W1.3-P1.90-LS2.4-BR]
Q83  AO3400A  [SOT-23-3_L2.9-W1.3-P1.90-LS2.4-BR]
Q84  AO3400A  [SOT-23-3_L2.9-W1.3-P1.90-LS2.4-BR]
Q85  AO3400A  [SOT-23-3_L2.9-W1.3-P1.90-LS2.4-BR]
Q86  AO3400A  [SOT-23-3_L2.9-W1.3-P1.90-LS2.4-BR]
Q87  AO3400A  [SOT-23-3_L2.9-W1.3-P1.90-LS2.4-BR]
Q88  AO3400A  [SOT-23-3_L2.9-W1.3-P1.90-LS2.4-BR]
Q89  AO3400A  [SOT-23-3_L2.9-W1.3-P1.90-LS2.4-BR]
Q90  AO3400A  [SOT-23-3_L2.9-W1.3-P1.90-LS2.4-BR]
R76  100R  [R0603]
R77  100R  [R0603]
R78  100R  [R0603]
R79  100R  [R0603]
R80  100R  [R0603]
R81  100R  [R0603]
R82  100R  [R0603]
R83  100R  [R0603]
R84  100R  [R0603]
R85  100R  [R0603]
R86  100R  [R0603]
R87  100R  [R0603]
R88  100R  [R0603]
R89  100R  [R0603]
R90  100R  [R0603]
U76  WF100E 1BG S6 DA 0.5P4.5 AT  [SOP-6_L7.0-W7.0-P2.54-LS10.3-TL-CW]
U77  WF100E 1BG S6 DA 0.5P4.5 AT  [SOP-6_L7.0-W7.0-P2.54-LS10.3-TL-CW]
U78  WF100E 1BG S6 DA 0.5P4.5 AT  [SOP-6_L7.0-W7.0-P2.54-LS10.3-TL-CW]
U79  WF100E 1BG S6 DA 0.5P4.5 AT  [SOP-6_L7.0-W7.0-P2.54-LS10.3-TL-CW]
U80  WF100E 1BG S6 DA 0.5P4.5 AT  [SOP-6_L7.0-W7.0-P2.54-LS10.3-TL-CW]
U81  WF100E 1BG S6 DA 0.5P4.5 AT  [SOP-6_L7.0-W7.0-P2.54-LS10.3-TL-CW]
U82  WF100E 1BG S6 DA 0.5P4.5 AT  [SOP-6_L7.0-W7.0-P2.54-LS10.3-TL-CW]
U83  WF100E 1BG S6 DA 0.5P4.5 AT  [SOP-6_L7.0-W7.0-P2.54-LS10.3-TL-CW]
U84  WF100E 1BG S6 DA 0.5P4.5 AT  [SOP-6_L7.0-W7.0-P2.54-LS10.3-TL-CW]
U85  WF100E 1BG S6 DA 0.5P4.5 AT  [SOP-6_L7.0-W7.0-P2.54-LS10.3-TL-CW]
U86  WF100E 1BG S6 DA 0.5P4.5 AT  [SOP-6_L7.0-W7.0-P2.54-LS10.3-TL-CW]
U87  WF100E 1BG S6 DA 0.5P4.5 AT  [SOP-6_L7.0-W7.0-P2.54-LS10.3-TL-CW]
U88  WF100E 1BG S6 DA 0.5P4.5 AT  [SOP-6_L7.0-W7.0-P2.54-LS10.3-TL-CW]
U89  WF100E 1BG S6 DA 0.5P4.5 AT  [SOP-6_L7.0-W7.0-P2.54-LS10.3-TL-CW]
U90  WF100E 1BG S6 DA 0.5P4.5 AT  [SOP-6_L7.0-W7.0-P2.54-LS10.3-TL-CW]

## Library data of the parts
C1-C90 = CAP_0603: Supplier Footprint: 0603
Q1-Q90 = AO3400A_C20917: LCSC Part Name: 1个N沟道 耐压:30V 电流:5.7A; Supplier Part: C20917; Manufacturer: AOS; Supplier Footprint: SOT-23-3L; JLCPCB Part Class: 基础库; Datasheet: https://item.szlcsc.com/datasheet/AO3400A/21629.html; Supplier: LCSC; Drain to Source Voltage: 30V; RDS(on): 48mΩ@2.5V; Gate Threshold Voltage (Vgs(th)): 1.45V@250uA; Gate Charge(Qg): 7nC@10V; Input Capacitance(Ciss): 630pF@15V; Operating Temperature: -55℃~+150℃@(Tj); Type: N沟道
R1-R90 = Res_0603: Supplier Footprint: 0603
U1-U90 = WF100E 1BG S6 DA 0.5P4.5 AT: Supplier Part: C22388670; Manufacturer: WF(伟烽); Supplier Footprint: SOP-6; JLCPCB Part Class: 扩展库; Datasheet: https://item.szlcsc.com/datasheet/WF100E%25201BG%2520S6%2520DA%25200.5P4.5%2520AT/23957601.html; Supplier: LCSC; Pressure range: 0Kpa~1bar; Voltage - Supply: 5V; Operating Temperature: -40℃~+125℃

## Nets
GND: C1.1 C2.1 C3.1 C4.1 C5.1 C6.1 C7.1 C8.1 C9.1 C10.1 C11.1 C12.1 C13.1 C14.1 C15.1 C16.1 C17.1 C18.1 C19.1 C20.1 C21.1 C22.1 C23.1 C24.1 C25.1 C26.1 C27.1 C28.1 C29.1 C30.1 C31.1 C32.1 C33.1 C34.1 C35.1 C36.1 C37.1 C38.1 C39.1 C40.1 C41.1 C42.1 C43.1 C44.1 C45.1 C46.1 C47.1 C48.1 C49.1 C50.1 C51.1 C52.1 C53.1 C54.1 C55.1 C56.1 C57.1 C58.1 C59.1 C60.1 C61.1 C62.1 C63.1 C64.1 C65.1 C66.1 C67.1 C68.1 C69.1 C70.1 C71.1 C72.1 C73.1 C74.1 C75.1 C76.1 C77.1 C78.1 C79.1 C80.1 C81.1 C82.1 C83.1 C84.1 C85.1 C86.1 C87.1 C88.1 C89.1 C90.1 U1.1(GND) U2.1(GND) U3.1(GND) U4.1(GND) U5.1(GND) U6.1(GND) U7.1(GND) U8.1(GND) U9.1(GND) U10.1(GND) U11.1(GND) U12.1(GND) U13.1(GND) U14.1(GND) U15.1(GND) U16.1(GND) U17.1(GND) U18.1(GND) U19.1(GND) U20.1(GND) U21.1(GND) U22.1(GND) U23.1(GND) U24.1(GND) U25.1(GND) U26.1(GND) U27.1(GND) U28.1(GND) U29.1(GND) U30.1(GND) U31.1(GND) U32.1(GND) U33.1(GND) U34.1(GND) U35.1(GND) U36.1(GND) U37.1(GND) U38.1(GND) U39.1(GND) U40.1(GND) U41.1(GND) U42.1(GND) U43.1(GND) U44.1(GND) U45.1(GND) U46.1(GND) U47.1(GND) U48.1(GND) U49.1(GND) U50.1(GND) U51.1(GND) U52.1(GND) U53.1(GND) U54.1(GND) U55.1(GND) U56.1(GND) U57.1(GND) U58.1(GND) U59.1(GND) U60.1(GND) U61.1(GND) U62.1(GND) U63.1(GND) U64.1(GND) U65.1(GND) U66.1(GND) U67.1(GND) U68.1(GND) U69.1(GND) U70.1(GND) U71.1(GND) U72.1(GND) U73.1(GND) U74.1(GND) U75.1(GND) U76.1(GND) U77.1(GND) U78.1(GND) U79.1(GND) U80.1(GND) U81.1(GND) U82.1(GND) U83.1(GND) U84.1(GND) U85.1(GND) U86.1(GND) U87.1(GND) U88.1(GND) U89.1(GND) U90.1(GND) ; also on sheet 7 8 9 10 11 12
VDD1: R1.1 R16.1 R31.1 R46.1 R61.1 R76.1 ; also on sheet 7 10
VDD2: R2.1 R17.1 R32.1 R47.1 R62.1 R77.1 ; also on sheet 7 10
VDD3: R3.1 R18.1 R33.1 R48.1 R63.1 R78.1 ; also on sheet 7 10
VDD4: R4.1 R19.1 R34.1 R49.1 R64.1 R79.1 ; also on sheet 7 10
VDD5: R5.1 R20.1 R35.1 R50.1 R65.1 R80.1 ; also on sheet 7 10
VDD6: R6.1 R21.1 R36.1 R51.1 R66.1 R81.1 ; also on sheet 7 10
VDD7: R7.1 R22.1 R37.1 R52.1 R67.1 R82.1 ; also on sheet 7 10
VDD8: R8.1 R23.1 R38.1 R53.1 R68.1 R83.1 ; also on sheet 7 10
VDD9: R9.1 R24.1 R39.1 R54.1 R69.1 R84.1 ; also on sheet 7 10
VDD10: R10.1 R25.1 R40.1 R55.1 R70.1 R85.1 ; also on sheet 7 10
VDD11: R11.1 R26.1 R41.1 R56.1 R71.1 R86.1 ; also on sheet 7 10
VDD12: R12.1 R27.1 R42.1 R57.1 R72.1 R87.1 ; also on sheet 7 10
VDD13: R13.1 R28.1 R43.1 R58.1 R73.1 R88.1 ; also on sheet 7 10
VDD14: R14.1 R29.1 R44.1 R59.1 R74.1 R89.1 ; also on sheet 7 10
VDD15: R15.1 R30.1 R45.1 R60.1 R75.1 R90.1 ; also on sheet 7 10
OUT1: Q1.3(D) Q2.3(D) Q3.3(D) Q4.3(D) Q5.3(D) Q6.3(D) Q7.3(D) Q8.3(D) Q9.3(D) Q10.3(D) Q11.3(D) Q12.3(D) Q13.3(D) Q14.3(D) Q15.3(D) ; also on sheet 8
OUT1_EN: Q1.1(G) Q16.1(G) Q31.1(G) Q46.1(G) Q61.1(G) Q76.1(G) ; also on sheet 7 12
OUT2: Q16.3(D) Q17.3(D) Q18.3(D) Q19.3(D) Q20.3(D) Q21.3(D) Q22.3(D) Q23.3(D) Q24.3(D) Q25.3(D) Q26.3(D) Q27.3(D) Q28.3(D) Q29.3(D) Q30.3(D) ; also on sheet 8
OUT2_EN: Q2.1(G) Q17.1(G) Q32.1(G) Q47.1(G) Q62.1(G) Q77.1(G) ; also on sheet 7 12
OUT3: Q31.3(D) Q32.3(D) Q33.3(D) Q34.3(D) Q35.3(D) Q36.3(D) Q37.3(D) Q38.3(D) Q39.3(D) Q40.3(D) Q41.3(D) Q42.3(D) Q43.3(D) Q44.3(D) Q45.3(D) ; also on sheet 8
OUT3_EN: Q3.1(G) Q18.1(G) Q33.1(G) Q48.1(G) Q63.1(G) Q78.1(G) ; also on sheet 7 12
OUT4: Q46.3(D) Q47.3(D) Q48.3(D) Q49.3(D) Q50.3(D) Q51.3(D) Q52.3(D) Q53.3(D) Q54.3(D) Q55.3(D) Q56.3(D) Q57.3(D) Q58.3(D) Q59.3(D) Q60.3(D) ; also on sheet 8
OUT4_EN: Q4.1(G) Q19.1(G) Q34.1(G) Q49.1(G) Q64.1(G) Q79.1(G) ; also on sheet 7 12
OUT5: Q61.3(D) Q62.3(D) Q63.3(D) Q64.3(D) Q65.3(D) Q66.3(D) Q67.3(D) Q68.3(D) Q69.3(D) Q70.3(D) Q71.3(D) Q72.3(D) Q73.3(D) Q74.3(D) Q75.3(D) ; also on sheet 8
OUT5_EN: Q5.1(G) Q20.1(G) Q35.1(G) Q50.1(G) Q65.1(G) Q80.1(G) ; also on sheet 7 12
OUT6: Q76.3(D) Q77.3(D) Q78.3(D) Q79.3(D) Q80.3(D) Q81.3(D) Q82.3(D) Q83.3(D) Q84.3(D) Q85.3(D) Q86.3(D) Q87.3(D) Q88.3(D) Q89.3(D) Q90.3(D) ; also on sheet 8
OUT6_EN: Q6.1(G) Q21.1(G) Q36.1(G) Q51.1(G) Q66.1(G) Q81.1(G) ; also on sheet 7 12
OUT7_EN: Q7.1(G) Q22.1(G) Q37.1(G) Q52.1(G) Q67.1(G) Q82.1(G) ; also on sheet 7 12
OUT8_EN: Q8.1(G) Q23.1(G) Q38.1(G) Q53.1(G) Q68.1(G) Q83.1(G) ; also on sheet 7 12
OUT9_EN: Q9.1(G) Q24.1(G) Q39.1(G) Q54.1(G) Q69.1(G) Q84.1(G) ; also on sheet 7 12
OUT10_EN: Q10.1(G) Q25.1(G) Q40.1(G) Q55.1(G) Q70.1(G) Q85.1(G) ; also on sheet 7 12
OUT11_EN: Q11.1(G) Q26.1(G) Q41.1(G) Q56.1(G) Q71.1(G) Q86.1(G) ; also on sheet 7 12
OUT12_EN: Q12.1(G) Q27.1(G) Q42.1(G) Q57.1(G) Q72.1(G) Q87.1(G) ; also on sheet 7 12
OUT13_EN: Q13.1(G) Q28.1(G) Q43.1(G) Q58.1(G) Q73.1(G) Q88.1(G) ; also on sheet 7 12
OUT14_EN: Q14.1(G) Q29.1(G) Q44.1(G) Q59.1(G) Q74.1(G) Q89.1(G) ; also on sheet 7 12
OUT15_EN: Q15.1(G) Q30.1(G) Q45.1(G) Q60.1(G) Q75.1(G) Q90.1(G) ; also on sheet 7 12
VPP1: U1.4(NC) U16.4(NC) U31.4(NC) U46.4(NC) U61.4(NC) U76.4(NC) ; also on sheet 7 11
VPP2: U2.4(NC) U17.4(NC) U32.4(NC) U47.4(NC) U62.4(NC) U77.4(NC) ; also on sheet 7 11
VPP3: U3.4(NC) U18.4(NC) U33.4(NC) U48.4(NC) U63.4(NC) U78.4(NC) ; also on sheet 7 11
VPP4: U4.4(NC) U19.4(NC) U34.4(NC) U49.4(NC) U64.4(NC) U79.4(NC) ; also on sheet 7 11
VPP5: U5.4(NC) U20.4(NC) U35.4(NC) U50.4(NC) U65.4(NC) U80.4(NC) ; also on sheet 7 11
VPP6: U6.4(NC) U21.4(NC) U36.4(NC) U51.4(NC) U66.4(NC) U81.4(NC) ; also on sheet 7 11
VPP7: U7.4(NC) U22.4(NC) U37.4(NC) U52.4(NC) U67.4(NC) U82.4(NC) ; also on sheet 7 11
VPP8: U8.4(NC) U23.4(NC) U38.4(NC) U53.4(NC) U68.4(NC) U83.4(NC) ; also on sheet 7 11
VPP9: U9.4(NC) U24.4(NC) U39.4(NC) U54.4(NC) U69.4(NC) U84.4(NC) ; also on sheet 7 11
VPP10: U10.4(NC) U25.4(NC) U40.4(NC) U55.4(NC) U70.4(NC) U85.4(NC) ; also on sheet 7 11
VPP11: U11.4(NC) U26.4(NC) U41.4(NC) U56.4(NC) U71.4(NC) U86.4(NC) ; also on sheet 7 11
VPP12: U12.4(NC) U27.4(NC) U42.4(NC) U57.4(NC) U72.4(NC) U87.4(NC) ; also on sheet 7 11
VPP13: U13.4(NC) U28.4(NC) U43.4(NC) U58.4(NC) U73.4(NC) U88.4(NC) ; also on sheet 7 11
VPP14: U14.4(NC) U29.4(NC) U44.4(NC) U59.4(NC) U74.4(NC) U89.4(NC) ; also on sheet 7 11
VPP15: U15.4(NC) U30.4(NC) U45.4(NC) U60.4(NC) U75.4(NC) U90.4(NC) ; also on sheet 7 11
$1N25762: C1.2 R1.2 U1.3(VDD)
$1N26198: Q1.2(S) U1.2(SO)
$1N26971: C2.2 R2.2 U2.3(VDD)
$1N26977: Q2.2(S) U2.2(SO)
$1N27167: C3.2 R3.2 U3.3(VDD)
$1N27173: Q3.2(S) U3.2(SO)
$1N27363: C4.2 R4.2 U4.3(VDD)
$1N27369: Q4.2(S) U4.2(SO)
$1N27559: C5.2 R5.2 U5.3(VDD)
$1N27565: Q5.2(S) U5.2(SO)
$1N28481: C6.2 R6.2 U6.3(VDD)
$1N28487: Q6.2(S) U6.2(SO)
$1N28494: C7.2 R7.2 U7.3(VDD)
$1N28500: Q7.2(S) U7.2(SO)
$1N28507: C8.2 R8.2 U8.3(VDD)
$1N28513: Q8.2(S) U8.2(SO)
$1N28520: C9.2 R9.2 U9.3(VDD)
$1N28526: Q9.2(S) U9.2(SO)
$1N28533: C10.2 R10.2 U10.3(VDD)
$1N28539: Q10.2(S) U10.2(SO)
$1N29461: C11.2 R11.2 U11.3(VDD)
$1N29467: Q11.2(S) U11.2(SO)
$1N29474: C12.2 R12.2 U12.3(VDD)
$1N29480: Q12.2(S) U12.2(SO)
$1N29487: C13.2 R13.2 U13.3(VDD)
$1N29493: Q13.2(S) U13.2(SO)
$1N29500: C14.2 R14.2 U14.3(VDD)
$1N29506: Q14.2(S) U14.2(SO)
$1N29513: C15.2 R15.2 U15.3(VDD)
$1N29519: Q15.2(S) U15.2(SO)
$2N15558: C16.2 R16.2 U16.3(VDD)
$2N15564: Q16.2(S) U16.2(SO)
$2N15571: C17.2 R17.2 U17.3(VDD)
$2N15577: Q17.2(S) U17.2(SO)
$2N15584: C18.2 R18.2 U18.3(VDD)
$2N15590: Q18.2(S) U18.2(SO)
$2N15597: C19.2 R19.2 U19.3(VDD)
$2N15603: Q19.2(S) U19.2(SO)
$2N15610: C20.2 R20.2 U20.3(VDD)
$2N15616: Q20.2(S) U20.2(SO)
$2N15623: C21.2 R21.2 U21.3(VDD)
$2N15629: Q21.2(S) U21.2(SO)
$2N15636: C22.2 R22.2 U22.3(VDD)
$2N15642: Q22.2(S) U22.2(SO)
$2N15649: C23.2 R23.2 U23.3(VDD)
$2N15655: Q23.2(S) U23.2(SO)
$2N15662: C24.2 R24.2 U24.3(VDD)
$2N15668: Q24.2(S) U24.2(SO)
$2N15675: C25.2 R25.2 U25.3(VDD)
$2N15681: Q25.2(S) U25.2(SO)
$2N15688: C26.2 R26.2 U26.3(VDD)
$2N15694: Q26.2(S) U26.2(SO)
$2N15701: C27.2 R27.2 U27.3(VDD)
$2N15707: Q27.2(S) U27.2(SO)
$2N15714: C28.2 R28.2 U28.3(VDD)
$2N15720: Q28.2(S) U28.2(SO)
$2N15727: C29.2 R29.2 U29.3(VDD)
$2N15733: Q29.2(S) U29.2(SO)
$2N15740: C30.2 R30.2 U30.3(VDD)
$2N15746: Q30.2(S) U30.2(SO)
$3N15558: C31.2 R31.2 U31.3(VDD)
$3N15564: Q31.2(S) U31.2(SO)
$3N15571: C32.2 R32.2 U32.3(VDD)
$3N15577: Q32.2(S) U32.2(SO)
$3N15584: C33.2 R33.2 U33.3(VDD)
$3N15590: Q33.2(S) U33.2(SO)
$3N15597: C34.2 R34.2 U34.3(VDD)
$3N15603: Q34.2(S) U34.2(SO)
$3N15610: C35.2 R35.2 U35.3(VDD)
$3N15616: Q35.2(S) U35.2(SO)
$3N15623: C36.2 R36.2 U36.3(VDD)
$3N15629: Q36.2(S) U36.2(SO)
$3N15636: C37.2 R37.2 U37.3(VDD)
$3N15642: Q37.2(S) U37.2(SO)
$3N15649: C38.2 R38.2 U38.3(VDD)
$3N15655: Q38.2(S) U38.2(SO)
$3N15662: C39.2 R39.2 U39.3(VDD)
$3N15668: Q39.2(S) U39.2(SO)
$3N15675: C40.2 R40.2 U40.3(VDD)
$3N15681: Q40.2(S) U40.2(SO)
$3N15688: C41.2 R41.2 U41.3(VDD)
$3N15694: Q41.2(S) U41.2(SO)
$3N15701: C42.2 R42.2 U42.3(VDD)
$3N15707: Q42.2(S) U42.2(SO)
$3N15714: C43.2 R43.2 U43.3(VDD)
$3N15720: Q43.2(S) U43.2(SO)
$3N15727: C44.2 R44.2 U44.3(VDD)
$3N15733: Q44.2(S) U44.2(SO)
$3N15740: C45.2 R45.2 U45.3(VDD)
$3N15746: Q45.2(S) U45.2(SO)
$4N15558: C46.2 R46.2 U46.3(VDD)
$4N15564: Q46.2(S) U46.2(SO)
$4N15570: C47.2 R47.2 U47.3(VDD)
$4N15576: Q47.2(S) U47.2(SO)
$4N15582: C48.2 R48.2 U48.3(VDD)
$4N15588: Q48.2(S) U48.2(SO)
$4N15594: C49.2 R49.2 U49.3(VDD)
$4N15600: Q49.2(S) U49.2(SO)
$4N15606: C50.2 R50.2 U50.3(VDD)
$4N15612: Q50.2(S) U50.2(SO)
$4N15618: C51.2 R51.2 U51.3(VDD)
$4N15624: Q51.2(S) U51.2(SO)
$4N15630: C52.2 R52.2 U52.3(VDD)
$4N15636: Q52.2(S) U52.2(SO)
$4N15642: C53.2 R53.2 U53.3(VDD)
$4N15648: Q53.2(S) U53.2(SO)
$4N15654: C54.2 R54.2 U54.3(VDD)
$4N15660: Q54.2(S) U54.2(SO)
$4N15666: C55.2 R55.2 U55.3(VDD)
$4N15672: Q55.2(S) U55.2(SO)
$4N15678: C56.2 R56.2 U56.3(VDD)
$4N15684: Q56.2(S) U56.2(SO)
$4N15690: C57.2 R57.2 U57.3(VDD)
$4N15696: Q57.2(S) U57.2(SO)
$4N15702: C58.2 R58.2 U58.3(VDD)
$4N15708: Q58.2(S) U58.2(SO)
$4N15714: C59.2 R59.2 U59.3(VDD)
$4N15720: Q59.2(S) U59.2(SO)
$4N15726: C60.2 R60.2 U60.3(VDD)
$4N15732: Q60.2(S) U60.2(SO)
$5N15558: C61.2 R61.2 U61.3(VDD)
$5N15564: Q61.2(S) U61.2(SO)
$5N15570: C62.2 R62.2 U62.3(VDD)
$5N15576: Q62.2(S) U62.2(SO)
$5N15582: C63.2 R63.2 U63.3(VDD)
$5N15588: Q63.2(S) U63.2(SO)
$5N15594: C64.2 R64.2 U64.3(VDD)
$5N15600: Q64.2(S) U64.2(SO)
$5N15606: C65.2 R65.2 U65.3(VDD)
$5N15612: Q65.2(S) U65.2(SO)
$5N15618: C66.2 R66.2 U66.3(VDD)
$5N15624: Q66.2(S) U66.2(SO)
$5N15630: C67.2 R67.2 U67.3(VDD)
$5N15636: Q67.2(S) U67.2(SO)
$5N15642: C68.2 R68.2 U68.3(VDD)
$5N15648: Q68.2(S) U68.2(SO)
$5N15654: C69.2 R69.2 U69.3(VDD)
$5N15660: Q69.2(S) U69.2(SO)
$5N15666: C70.2 R70.2 U70.3(VDD)
$5N15672: Q70.2(S) U70.2(SO)
$5N15678: C71.2 R71.2 U71.3(VDD)
$5N15684: Q71.2(S) U71.2(SO)
$5N15690: C72.2 R72.2 U72.3(VDD)
$5N15696: Q72.2(S) U72.2(SO)
$5N15702: C73.2 R73.2 U73.3(VDD)
$5N15708: Q73.2(S) U73.2(SO)
$5N15714: C74.2 R74.2 U74.3(VDD)
$5N15720: Q74.2(S) U74.2(SO)
$5N15726: C75.2 R75.2 U75.3(VDD)
$5N15732: Q75.2(S) U75.2(SO)
$6N13516: C76.2 R76.2 U76.3(VDD)
$6N13522: Q76.2(S) U76.2(SO)
$6N13528: C77.2 R77.2 U77.3(VDD)
$6N13534: Q77.2(S) U77.2(SO)
$6N13540: C78.2 R78.2 U78.3(VDD)
$6N13546: Q78.2(S) U78.2(SO)
$6N13552: C79.2 R79.2 U79.3(VDD)
$6N13558: Q79.2(S) U79.2(SO)
$6N13564: C80.2 R80.2 U80.3(VDD)
$6N13570: Q80.2(S) U80.2(SO)
$6N13576: C81.2 R81.2 U81.3(VDD)
$6N13582: Q81.2(S) U81.2(SO)
$6N13588: C82.2 R82.2 U82.3(VDD)
$6N13594: Q82.2(S) U82.2(SO)
$6N13600: C83.2 R83.2 U83.3(VDD)
$6N13606: Q83.2(S) U83.2(SO)
$6N13612: C84.2 R84.2 U84.3(VDD)
$6N13618: Q84.2(S) U84.2(SO)
$6N13624: C85.2 R85.2 U85.3(VDD)
$6N13630: Q85.2(S) U85.2(SO)
$6N13636: C86.2 R86.2 U86.3(VDD)
$6N13642: Q86.2(S) U86.2(SO)
$6N13648: C87.2 R87.2 U87.3(VDD)
$6N13654: Q87.2(S) U87.2(SO)
$6N13660: C88.2 R88.2 U88.3(VDD)
$6N13666: Q88.2(S) U88.2(SO)
$6N13672: C89.2 R89.2 U89.3(VDD)
$6N13678: Q89.2(S) U89.2(SO)
$6N13684: C90.2 R90.2 U90.3(VDD)
$6N13690: Q90.2(S) U90.2(SO)

Not connected (* = marked no-connect by the designer): U1 5(NC)* 6(NC)*; U2 5(NC)* 6(NC)*; U3 5(NC)* 6(NC)*; U4 5(NC)* 6(NC)*; U5 5(NC)* 6(NC)*; U6 5(NC)* 6(NC)*; U7 5(NC)* 6(NC)*; U8 5(NC)* 6(NC)*; U9 5(NC)* 6(NC)*; U10 5(NC)* 6(NC)*; U11 5(NC)* 6(NC)*; U12 5(NC)* 6(NC)*; U13 5(NC)* 6(NC)*; U14 5(NC)* 6(NC)*; U15 5(NC)* 6(NC)*; U16 5(NC)* 6(NC)*; U17 5(NC)* 6(NC)*; U18 5(NC)* 6(NC)*; U19 5(NC)* 6(NC)*; U20 5(NC)* 6(NC)*; U21 5(NC)* 6(NC)*; U22 5(NC)* 6(NC)*; U23 5(NC)* 6(NC)*; U24 5(NC)* 6(NC)*; U25 5(NC)* 6(NC)*; U26 5(NC)* 6(NC)*; U27 5(NC)* 6(NC)*; U28 5(NC)* 6(NC)*; U29 5(NC)* 6(NC)*; U30 5(NC)* 6(NC)*; U31 5(NC)* 6(NC)*; U32 5(NC)* 6(NC)*; U33 5(NC)* 6(NC)*; U34 5(NC)* 6(NC)*; U35 5(NC)* 6(NC)*; U36 5(NC)* 6(NC)*; U37 5(NC)* 6(NC)*; U38 5(NC)* 6(NC)*; U39 5(NC)* 6(NC)*; U40 5(NC)* 6(NC)*; U41 5(NC)* 6(NC)*; U42 5(NC)* 6(NC)*; U43 5(NC)* 6(NC)*; U44 5(NC)* 6(NC)*; U45 5(NC)* 6(NC)*; U46 5(NC)* 6(NC)*; U47 5(NC)* 6(NC)*; U48 5(NC)* 6(NC)*; U49 5(NC)* 6(NC)*; U50 5(NC)* 6(NC)*; U51 5(NC)* 6(NC)*; U52 5(NC)* 6(NC)*; U53 5(NC)* 6(NC)*; U54 5(NC)* 6(NC)*; U55 5(NC)* 6(NC)*; U56 5(NC)* 6(NC)*; U57 5(NC)* 6(NC)*; U58 5(NC)* 6(NC)*; U59 5(NC)* 6(NC)*; U60 5(NC)* 6(NC)*; U61 5(NC)* 6(NC)*; U62 5(NC)* 6(NC)*; U63 5(NC)* 6(NC)*; U64 5(NC)* 6(NC)*; U65 5(NC)* 6(NC)*; U66 5(NC)* 6(NC)*; U67 5(NC)* 6(NC)*; U68 5(NC)* 6(NC)*; U69 5(NC)* 6(NC)*; U70 5(NC)* 6(NC)*; U71 5(NC)* 6(NC)*; U72 5(NC)* 6(NC)*; U73 5(NC)* 6(NC)*; U74 5(NC)* 6(NC)*; U75 5(NC)* 6(NC)*; U76 5(NC)* 6(NC)*; U77 5(NC)* 6(NC)*; U78 5(NC)* 6(NC)*; U79 5(NC)* 6(NC)*; U80 5(NC)* 6(NC)*; U81 5(NC)* 6(NC)*; U82 5(NC)* 6(NC)*; U83 5(NC)* 6(NC)*; U84 5(NC)* 6(NC)*; U85 5(NC)* 6(NC)*; U86 5(NC)* 6(NC)*; U87 5(NC)* 6(NC)*; U88 5(NC)* 6(NC)*; U89 5(NC)* 6(NC)*; U90 5(NC)* 6(NC)*
